# EasyEDA Pro project EjemploESP32.epro

# Schematic Schematic1_V2

## Sheets
1 P1: Board Name: Board_INA219_V2; Create Date: 2026-09-01; Page Name: P1; Project Name: Project Name; Schematic Name: Schematic Name; Update Date: 2021.11.05; Company: EasyEDA.com; Page Size: A4; Version: V1.0
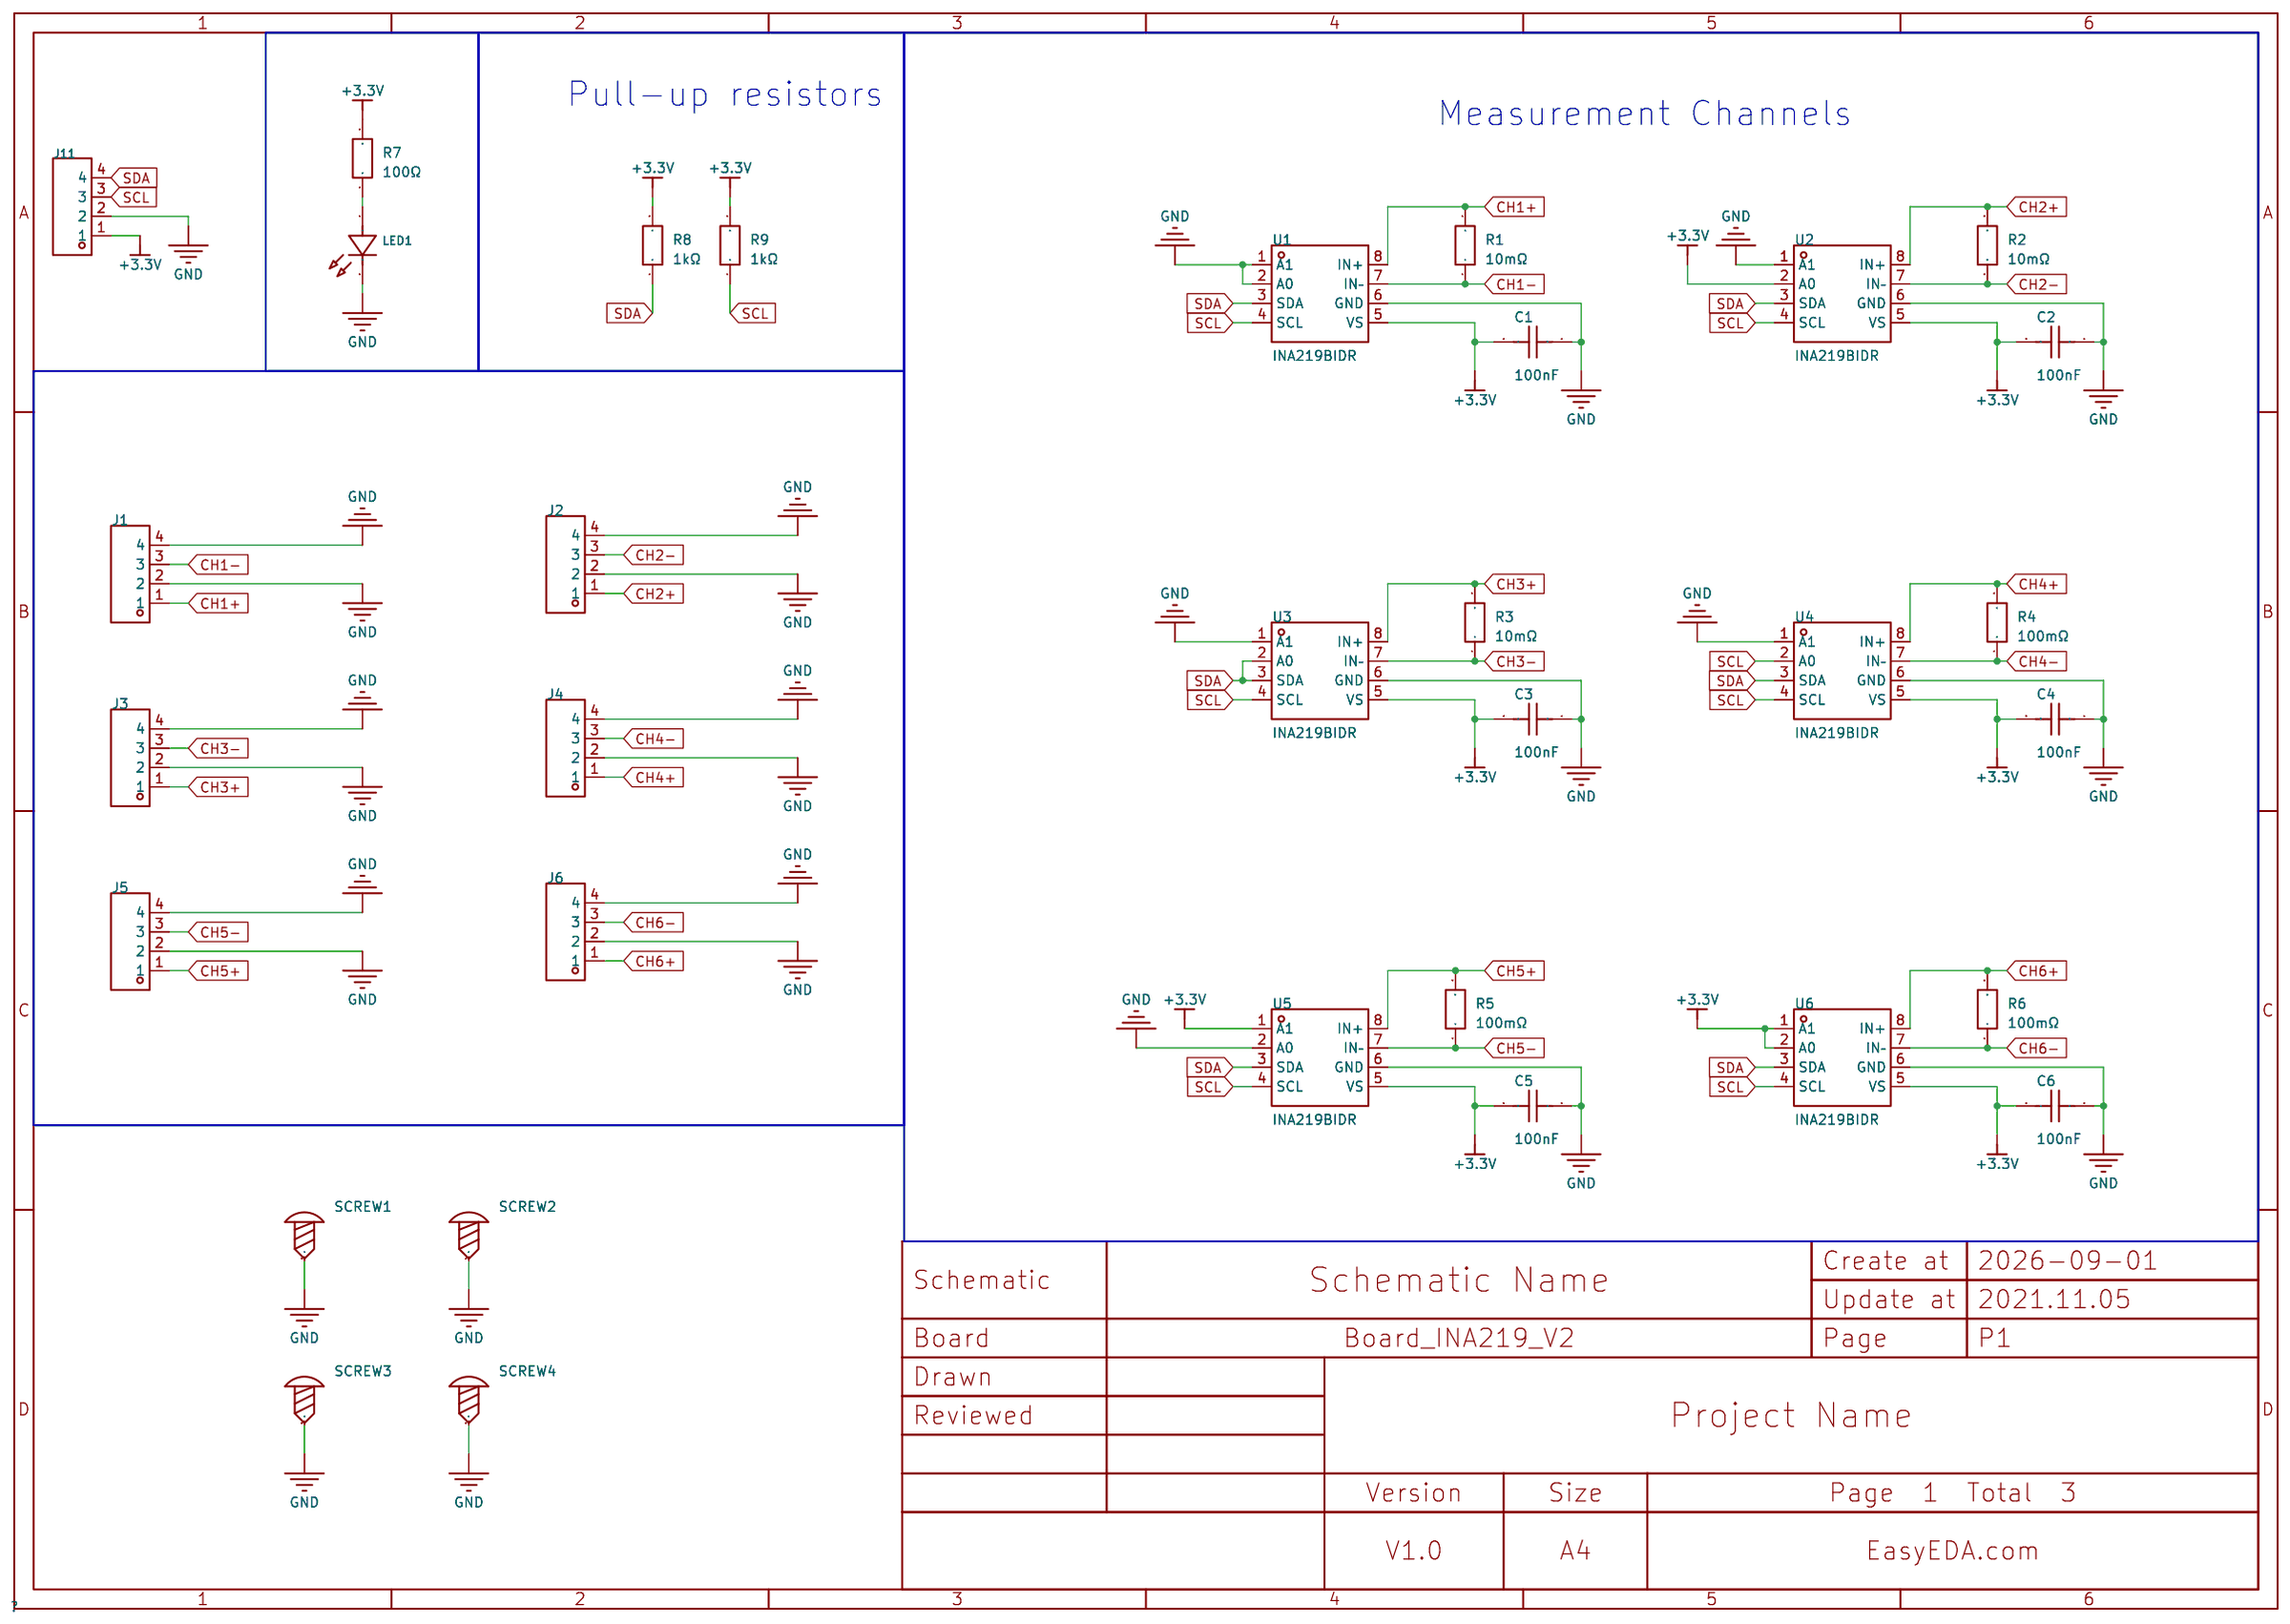
[diagram p0: P1]
2 P2: Create Date: 2026-09-20; Page Name: P2; Project Name: Measurment Unit; Schematic Name: Schematic1_V2; Update Date: 2026-09-20
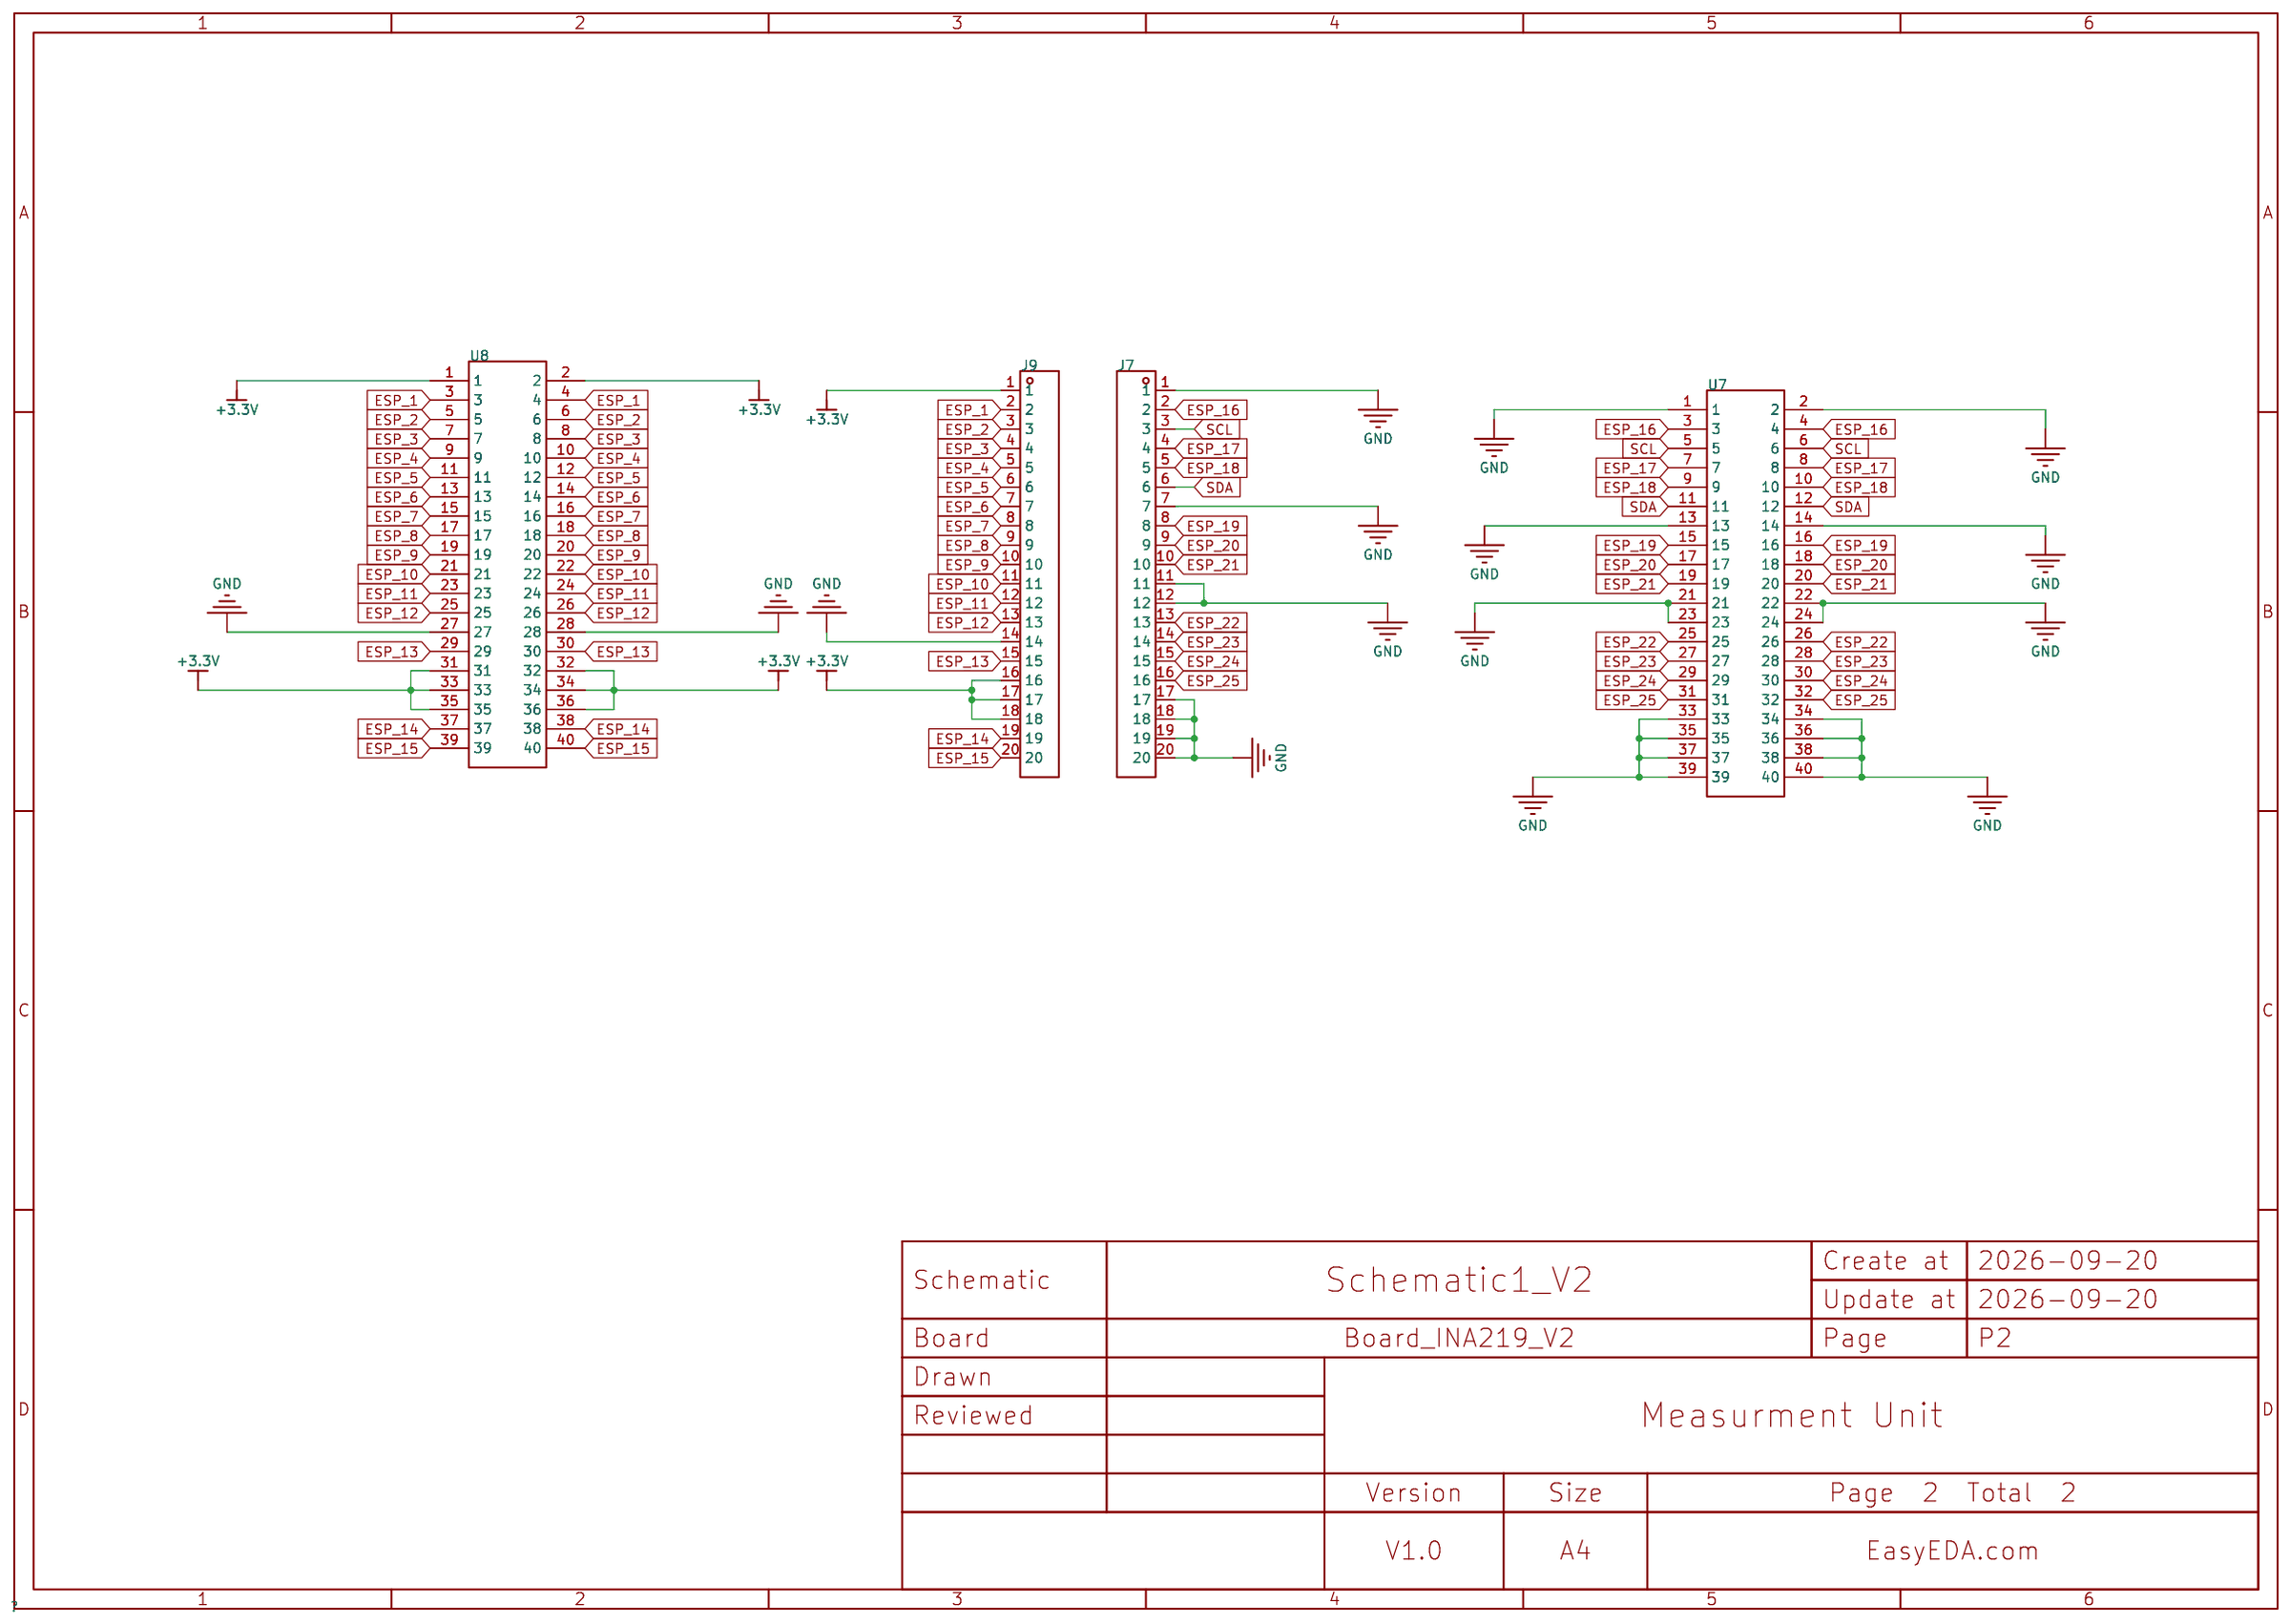
[diagram p1: P2]

## Parts
sheet P1
C1  100nF  [C0805]
C2  100nF  [C0805]
C3  100nF  [C0805]
C4  100nF  [C0805]
C5  100nF  [C0805]
C6  100nF  [C0805]
J1  JL301-50004U02  [CONN-TH_4P-P5.00_JL301-50004U02]
J2  JL301-50004U02  [CONN-TH_4P-P5.00_JL301-50004U02]
J3  JL301-50004U02  [CONN-TH_4P-P5.00_JL301-50004U02]
J4  JL301-50004U02  [CONN-TH_4P-P5.00_JL301-50004U02]
J5  JL301-50004U02  [CONN-TH_4P-P5.00_JL301-50004U02]
J6  JL301-50004U02  [CONN-TH_4P-P5.00_JL301-50004U02]
J11  PM2.54-1*4  [HDR-TH_4P-P2.54-V-F]
LED1  XL-3216SURC  [LED1206-R-RD_RED]
R1  10mΩ  [R2512]
R2  10mΩ  [R2512]
R3  10mΩ  [R2512]
R4  100mΩ  [R2512]
R5  100mΩ  [R2512]
R6  100mΩ  [R2512]
R7  100Ω  [R1206]
R8  1kΩ  [R1206]
R9  1kΩ  [R1206]
SCREW1  -  [Screw-Hole-M2]
SCREW2  -  [Screw-Hole-M2]
SCREW3  -  [Screw-Hole-M2]
SCREW4  -  [Screw-Hole-M2]
U1  INA219BIDR  [SOIC-8_L5.0-W4.0-P1.27-LS6.1-BL]
U2  INA219BIDR  [SOIC-8_L5.0-W4.0-P1.27-LS6.1-BL]
U3  INA219BIDR  [SOIC-8_L5.0-W4.0-P1.27-LS6.1-BL]
U4  INA219BIDR  [SOIC-8_L5.0-W4.0-P1.27-LS6.1-BL]
U5  INA219BIDR  [SOIC-8_L5.0-W4.0-P1.27-LS6.1-BL]
U6  INA219BIDR  [SOIC-8_L5.0-W4.0-P1.27-LS6.1-BL]
sheet P2
J7  ZX-PM2.54-1-20PY  [HDR-TH_20P-P2.54-V-F]
J9  ZX-PM2.54-1-20PY  [HDR-TH_20P-P2.54-V-F]
U7  2.54-2*20  [HDR-TH_40P-P2.54-V-F-R2-C20-S2.54]
U8  2.54-2*20  [HDR-TH_40P-P2.54-V-F-R2-C20-S2.54]

## Library data of the parts
C1-C6 = CAP_0805: Supplier Footprint: 0805
J1-J6 = JL301-50004U02: Number of Positions or Pins:1x4P Pitch:5mm Color:Blue Mounting Type:Through Hole Number of Pins:4P Number of Rows:1 Number of PINs Per Row:4 Screw Specification:M2.5 Current Rating:15A Voltage Rating (Max):300V Wire Gauge - AWG:12~24 Operating Temperature; LCSC Part Name: 1x4P 5mm 直插 排数:1 每排P数:4; Supplier Part: C409137; Manufacturer: JILN(锦凌); Supplier Footprint: 插件,P=5mm; JLCPCB Part Class: Extended Part; Datasheet: https://item.szlcsc.com/datasheet/JL301-50004U02/399067.html; Supplier: LCSC; Number of Positions or Pins: 1x4P; Pitch: 5mm; Color: Blue; Mounting Type: Through Hole; Number of Pins: 4P; Number of Rows: 1; Number of PINs Per Row: 4; Screw Specification: M2.5; Current Rating: 15A; Voltage Rating (Max): 300V; Wire Gauge - AWG: 12~24; Operating Temperature: -40℃~+105℃; Height Above Board: 10.1mm
J11 = PM2.54-1*4: Holes Structure:1x4P Pitch:2.54mm Row Spacing:2.54mm Circular Hole / Square Hole:Square Hole Mounting Type:Through Hole Number of Rows:1 Number of Positions:4P Current Rating:2.5A Holes Direction:Top Insulation Height:8.5mm Operating Temperature:-40℃~+105; LCSC Part Name: 间距:2.54mm 1x4P 直插; Supplier Part: C5116530; Manufacturer: ZHOURI(洲日); Supplier Footprint: 插件,P=2.54mm; JLCPCB Part Class: Extended Part; Datasheet: https://item.szlcsc.com/datasheet/PM2.54-1*4/5692947.html; Supplier: LCSC; Holes Structure: 1x4P; Pitch: 2.54mm; Row Spacing: 2.54mm; Circular Hole / Square Hole: Square Hole; Mounting Type: Through Hole; Number of Rows: 1; Number of Positions: 4P; Current Rating: 2.5A; Holes Direction: Top; Insulation Height: 8.5mm; Operating Temperature: -40℃~+105℃
LED1 = XL-3216SURC: Lamp Holder Type:3.2mm x 1.6mm square LED Illumination Color:Red Voltage - Forward(Vf):2.4V Voltage - Forward(Vf):2.4V Power(Watts):50mW Forward Current:20mA Wavelength - Dominant:615nm~630nm Wavelength - Dominant:615nm~630nm Peak Wavelength:620nm Peak Wa; LCSC Part Name: 1206红贴片式发光二极管; Supplier Part: C965822; Manufacturer: XINGLIGHT(成兴光); Supplier Footprint: 1206; JLCPCB Part Class: Extended Part; Datasheet: https://item.szlcsc.com/datasheet/XL-3216SURC/1051431.html; Supplier: LCSC; Lamp Holder Type: 3.2mm x 1.6mm square LED; Illumination Color: Red; Voltage - Forward(Vf): 2.4V; Power(Watts): 50mW; Forward Current: 20mA; Wavelength - Dominant: 615nm~630nm; Peak Wavelength: 620nm; Diode Configuration: Discrete Diode; Lens Color: Water Clear; Luminous Intensity: 225mcd; Viewing Angle: 120°; Mounting Style: Top-mount; Operating Temperature: -40℃~+85℃
R1-R3 = FRM252WJR010TN: Type:Current Sense Resistor Resistance:10mΩ Tolerance:±5% Tolerance:±5% Power(Watts):2W Temperature Coefficient:±50ppm/℃ Temperature Coefficient:±50ppm/℃ Mounting Type:SMD; LCSC Part Name: 10mΩ ±5% 2W 合金电阻; Supplier Part: C7420034; Manufacturer: FOJAN(富捷); Supplier Footprint: 2512; JLCPCB Part Class: Extended Part; Datasheet: https://item.szlcsc.com/datasheet/FRM252WJR010TN/8395327.html; Supplier: LCSC; Type: Current Sense Resistor; Tolerance: ±5%; Power(Watts): 2W; Temperature Coefficient: ±50ppm/℃; Mounting Type: SMD
R4-R6 = FRM252WJR100TN: Type:Current Sense Resistor Resistance:100mΩ Tolerance:±5% Tolerance:±5% Voltage Rating:- Power(Watts):2W Current Rating:- Temperature Coefficient:±50ppm/℃ Temperature Coefficient:±50ppm/℃ Mounting Type:-; LCSC Part Name: 100mΩ ±5% 2W; Supplier Part: C7467234; Manufacturer: FOJAN(富捷); Supplier Footprint: 2512; JLCPCB Part Class: Extended Part; Datasheet: https://item.szlcsc.com/datasheet/FRM252WJR100TN/8513834.html; Supplier: LCSC; Type: Current Sense Resistor; Tolerance: ±5%; Power(Watts): 2W; Temperature Coefficient: ±50ppm/℃
R7 = FRC1206J101 TS: Type:Thick Film Resistor Resistance:100Ω Tolerance:±5% Tolerance:±5% Power(Watts):250mW Voltage-Supply(Max):200V Temperature Coefficient:±100ppm/℃ Temperature Coefficient:±100ppm/℃ Operating Temperature:-55℃~+155℃ Operating Temperature:-55℃~+155℃; LCSC Part Name: 100Ω ±5% 250mW 厚膜电阻; Supplier Part: C2907422; Manufacturer: FOJAN(富捷); Supplier Footprint: 1206; JLCPCB Part Class: Extended Part; Supplier: LCSC; Type: Thick Film Resistor; Tolerance: ±5%; Power(Watts): 250mW; Voltage-Supply(Max): 200V; Temperature Coefficient: ±100ppm/℃; Operating Temperature: -55℃~+155℃
R8 R9 = FRC1206J102 TS: Type:Thick Film Resistor Resistance:1kΩ Tolerance:±5% Tolerance:±5% Power(Watts):250mW Voltage-Supply(Max):200V Temperature Coefficient:±100ppm/℃ Temperature Coefficient:±100ppm/℃ Operating Temperature:-55℃~+155℃ Operating Temperature:-55℃~+155℃; LCSC Part Name: 1kΩ ±5% 250mW 厚膜电阻; Supplier Part: C2907440; Manufacturer: FOJAN(富捷); Supplier Footprint: 1206; JLCPCB Part Class: Extended Part; Supplier: LCSC; Type: Thick Film Resistor; Tolerance: ±5%; Power(Watts): 250mW; Voltage-Supply(Max): 200V; Temperature Coefficient: ±100ppm/℃; Operating Temperature: -55℃~+155℃
SCREW1-SCREW4 = Screw-Hole-M2: Supplier Footprint: 插件
U1-U6 = INA219BIDR: Number of Channels:- Vcm - Common Mode Voltage:300mV~26V Vcm - Common Mode Voltage:300mV~26V Gain:- Bandwidth:- Ib - Input Bias Current:20uA Vos - Input Offset Voltage:10uV Operating Temperature:-40℃~+125℃ Operating Temperature:-40℃~+125℃ Differential Vol; LCSC Part Name: 具有I2C接口的零漂移双向电流/功率监测计; Supplier Part: C2155799; Manufacturer: TI(德州仪器); Supplier Footprint: SOIC-8; JLCPCB Part Class: Extended Part; Datasheet: https://www.ti.com/cn/lit/gpn/ina219; Supplier: LCSC; Vcm - Common Mode Voltage: 300mV~26V; Ib - Input Bias Current: 20uA; Vos - Input Offset Voltage: 10uV; Operating Temperature: -40℃~+125℃; Differential Voltage: -26V~+26V; Single Supply: 3V~5.5V; Quiescent Current: 700uA; Input Offset Voltage Drift(Vos TC): 0.1uV/℃; Common Mode Rejection Ratio (CMRR): 120dB
J7 J9 = ZX-PM2.54-1-20PY: Holes Structure:1x20P Pitch:2.54mm Row Spacing:- Circular Hole / Square Hole:Square Hole Mounting Type:Through Hole Number of Rows:1 Number of Positions:20P Current Rating:3A Voltage Rating (Max):- Holes Direction:Top Insulation Height:8.5mm Contact Mater; LCSC Part Name: 1x20P 间距:2.54mm 直插; Supplier Part: C7499336; Manufacturer: Megastar(兆星); Supplier Footprint: 插件,P=2.54mm; JLCPCB Part Class: Extended Part; Datasheet: https://item.szlcsc.com/datasheet/ZX-PM2.54-1-20PY/8573997.html; Supplier: LCSC; Holes Structure: 1x20P; Pitch: 2.54mm; Circular Hole / Square Hole: Square Hole; Mounting Type: Through Hole; Number of Rows: 1; Number of Positions: 20P; Current Rating: 3A; Holes Direction: Top; Insulation Height: 8.5mm; Contact Material: Brass; Contact Plating: Gold; Operating Temperature: -40℃~+105℃; PIN Length: 3.2mm
U7 U8 = 2.54-2*20: Holes Structure:2x20P Pitch:2.54mm Row Spacing:2.54mm Circular Hole / Square Hole:Square Hole Mounting Type:Through Hole Number of Rows:2 Number of Positions:40P Current Rating:2.5A Voltage Rating (Max):- Holes Direction:Top Insulation Height:8.5mm Operat; LCSC Part Name: 间距:2.54mm 2x20P 直插; Supplier Part: C2977589; Manufacturer: ZHOURI(洲日); Supplier Footprint: 插件,P=2.54mm; JLCPCB Part Class: Extended Part; Datasheet: https://item.szlcsc.com/datasheet/2.54-2*20/3388941.html; Supplier: LCSC; Holes Structure: 2x20P; Pitch: 2.54mm; Row Spacing: 2.54mm; Circular Hole / Square Hole: Square Hole; Mounting Type: Through Hole; Number of Rows: 2; Number of Positions: 40P; Current Rating: 2.5A; Holes Direction: Top; Insulation Height: 8.5mm; Operating Temperature: -40℃~+105℃

## Nets
+3.3V: C1.2 C2.2 C3.2 C4.2 C5.2 C6.2 J9.1 J9.16 J9.17 J9.18 J11.1 R7.2 R8.2 R9.2 U1.5(VS) U2.2(A0) U2.5(VS) U3.5(VS) U4.5(VS) U5.1(A1) U5.5(VS) U6.1(A1) U6.2(A0) U6.5(VS) U8.1 U8.2 U8.31 U8.32 U8.33 U8.34 U8.35 U8.36
GND: C1.1 C2.1 C3.1 C4.1 C5.1 C6.1 J1.2 J1.4 J2.2 J2.4 J3.2 J3.4 J4.2 J4.4 J5.2 J5.4 J6.2 J6.4 J7.1 J7.7 J7.11 J7.12 J7.17 J7.18 J7.19 J7.20 J9.14 J11.2 LED1.2(A) SCREW1.1 SCREW2.1 SCREW3.1 SCREW4.1 U1.1(A1) U1.2(A0) U1.6(GND) U2.1(A1) U2.6(GND) U3.1(A1) U3.6(GND) U4.1(A1) U4.6(GND) U5.2(A0) U5.6(GND) U6.6(GND) U7.1 U7.2 U7.13 U7.14 U7.21 U7.22 U7.23 U7.24 U7.33 U7.34 U7.35 U7.36 U7.37 U7.38 U7.39 U7.40 U8.27 U8.28
CH1+: J1.1 R1.2 U1.8(IN+)
CH1-: J1.3 R1.1 U1.7(IN–)
CH2+: J2.1 R2.2 U2.8(IN+)
CH2-: J2.3 R2.1 U2.7(IN–)
CH3+: J3.1 R3.2 U3.8(IN+)
CH3-: J3.3 R3.1 U3.7(IN–)
CH4+: J4.1 R4.2 U4.8(IN+)
CH4-: J4.3 R4.1 U4.7(IN–)
CH5+: J5.1 R5.2 U5.8(IN+)
CH5-: J5.3 R5.1 U5.7(IN–)
CH6+: J6.1 R6.2 U6.8(IN+)
CH6-: J6.3 R6.1 U6.7(IN–)
ESP_1: J9.2 U8.3 U8.4
ESP_2: J9.3 U8.5 U8.6
ESP_3: J9.4 U8.7 U8.8
ESP_4: J9.5 U8.9 U8.10
ESP_5: J9.6 U8.11 U8.12
ESP_6: J9.7 U8.13 U8.14
ESP_7: J9.8 U8.15 U8.16
ESP_8: J9.9 U8.17 U8.18
ESP_9: J9.10 U8.19 U8.20
ESP_10: J9.11 U8.21 U8.22
ESP_11: J9.12 U8.23 U8.24
ESP_12: J9.13 U8.25 U8.26
ESP_13: J9.15 U8.29 U8.30
ESP_14: J9.19 U8.37 U8.38
ESP_15: J9.20 U8.39 U8.40
ESP_16: J7.2 U7.3 U7.4
ESP_17: J7.4 U7.7 U7.8
ESP_18: J7.5 U7.9 U7.10
ESP_19: J7.8 U7.15 U7.16
ESP_20: J7.9 U7.17 U7.18
ESP_21: J7.10 U7.19 U7.20
ESP_22: J7.13 U7.25 U7.26
ESP_23: J7.14 U7.27 U7.28
ESP_24: J7.15 U7.29 U7.30
ESP_25: J7.16 U7.31 U7.32
SCL: J7.3 J11.3 R9.1 U1.4(SCL) U2.4(SCL) U3.4(SCL) U4.2(A0) U4.4(SCL) U5.4(SCL) U6.4(SCL) U7.5 U7.6
SDA: J7.6 J11.4 R8.1 U1.3(SDA) U2.3(SDA) U3.2(A0) U3.3(SDA) U4.3(SDA) U5.3(SDA) U6.3(SDA) U7.11 U7.12
$1N117: LED1.1(K) R7.1

## Notes on the sheets
sheet 1
- Pull-up resistors
- Measurement Channels

# Schematic Schematic1

## Sheets
1 P1: Create Date: 2026-09-01; Page Name: P1; Project Name: Project Name; Schematic Name: Schematic Name; Update Date: 2021.11.05; Company: EasyEDA.com; Page Size: A4; Version: V1.0
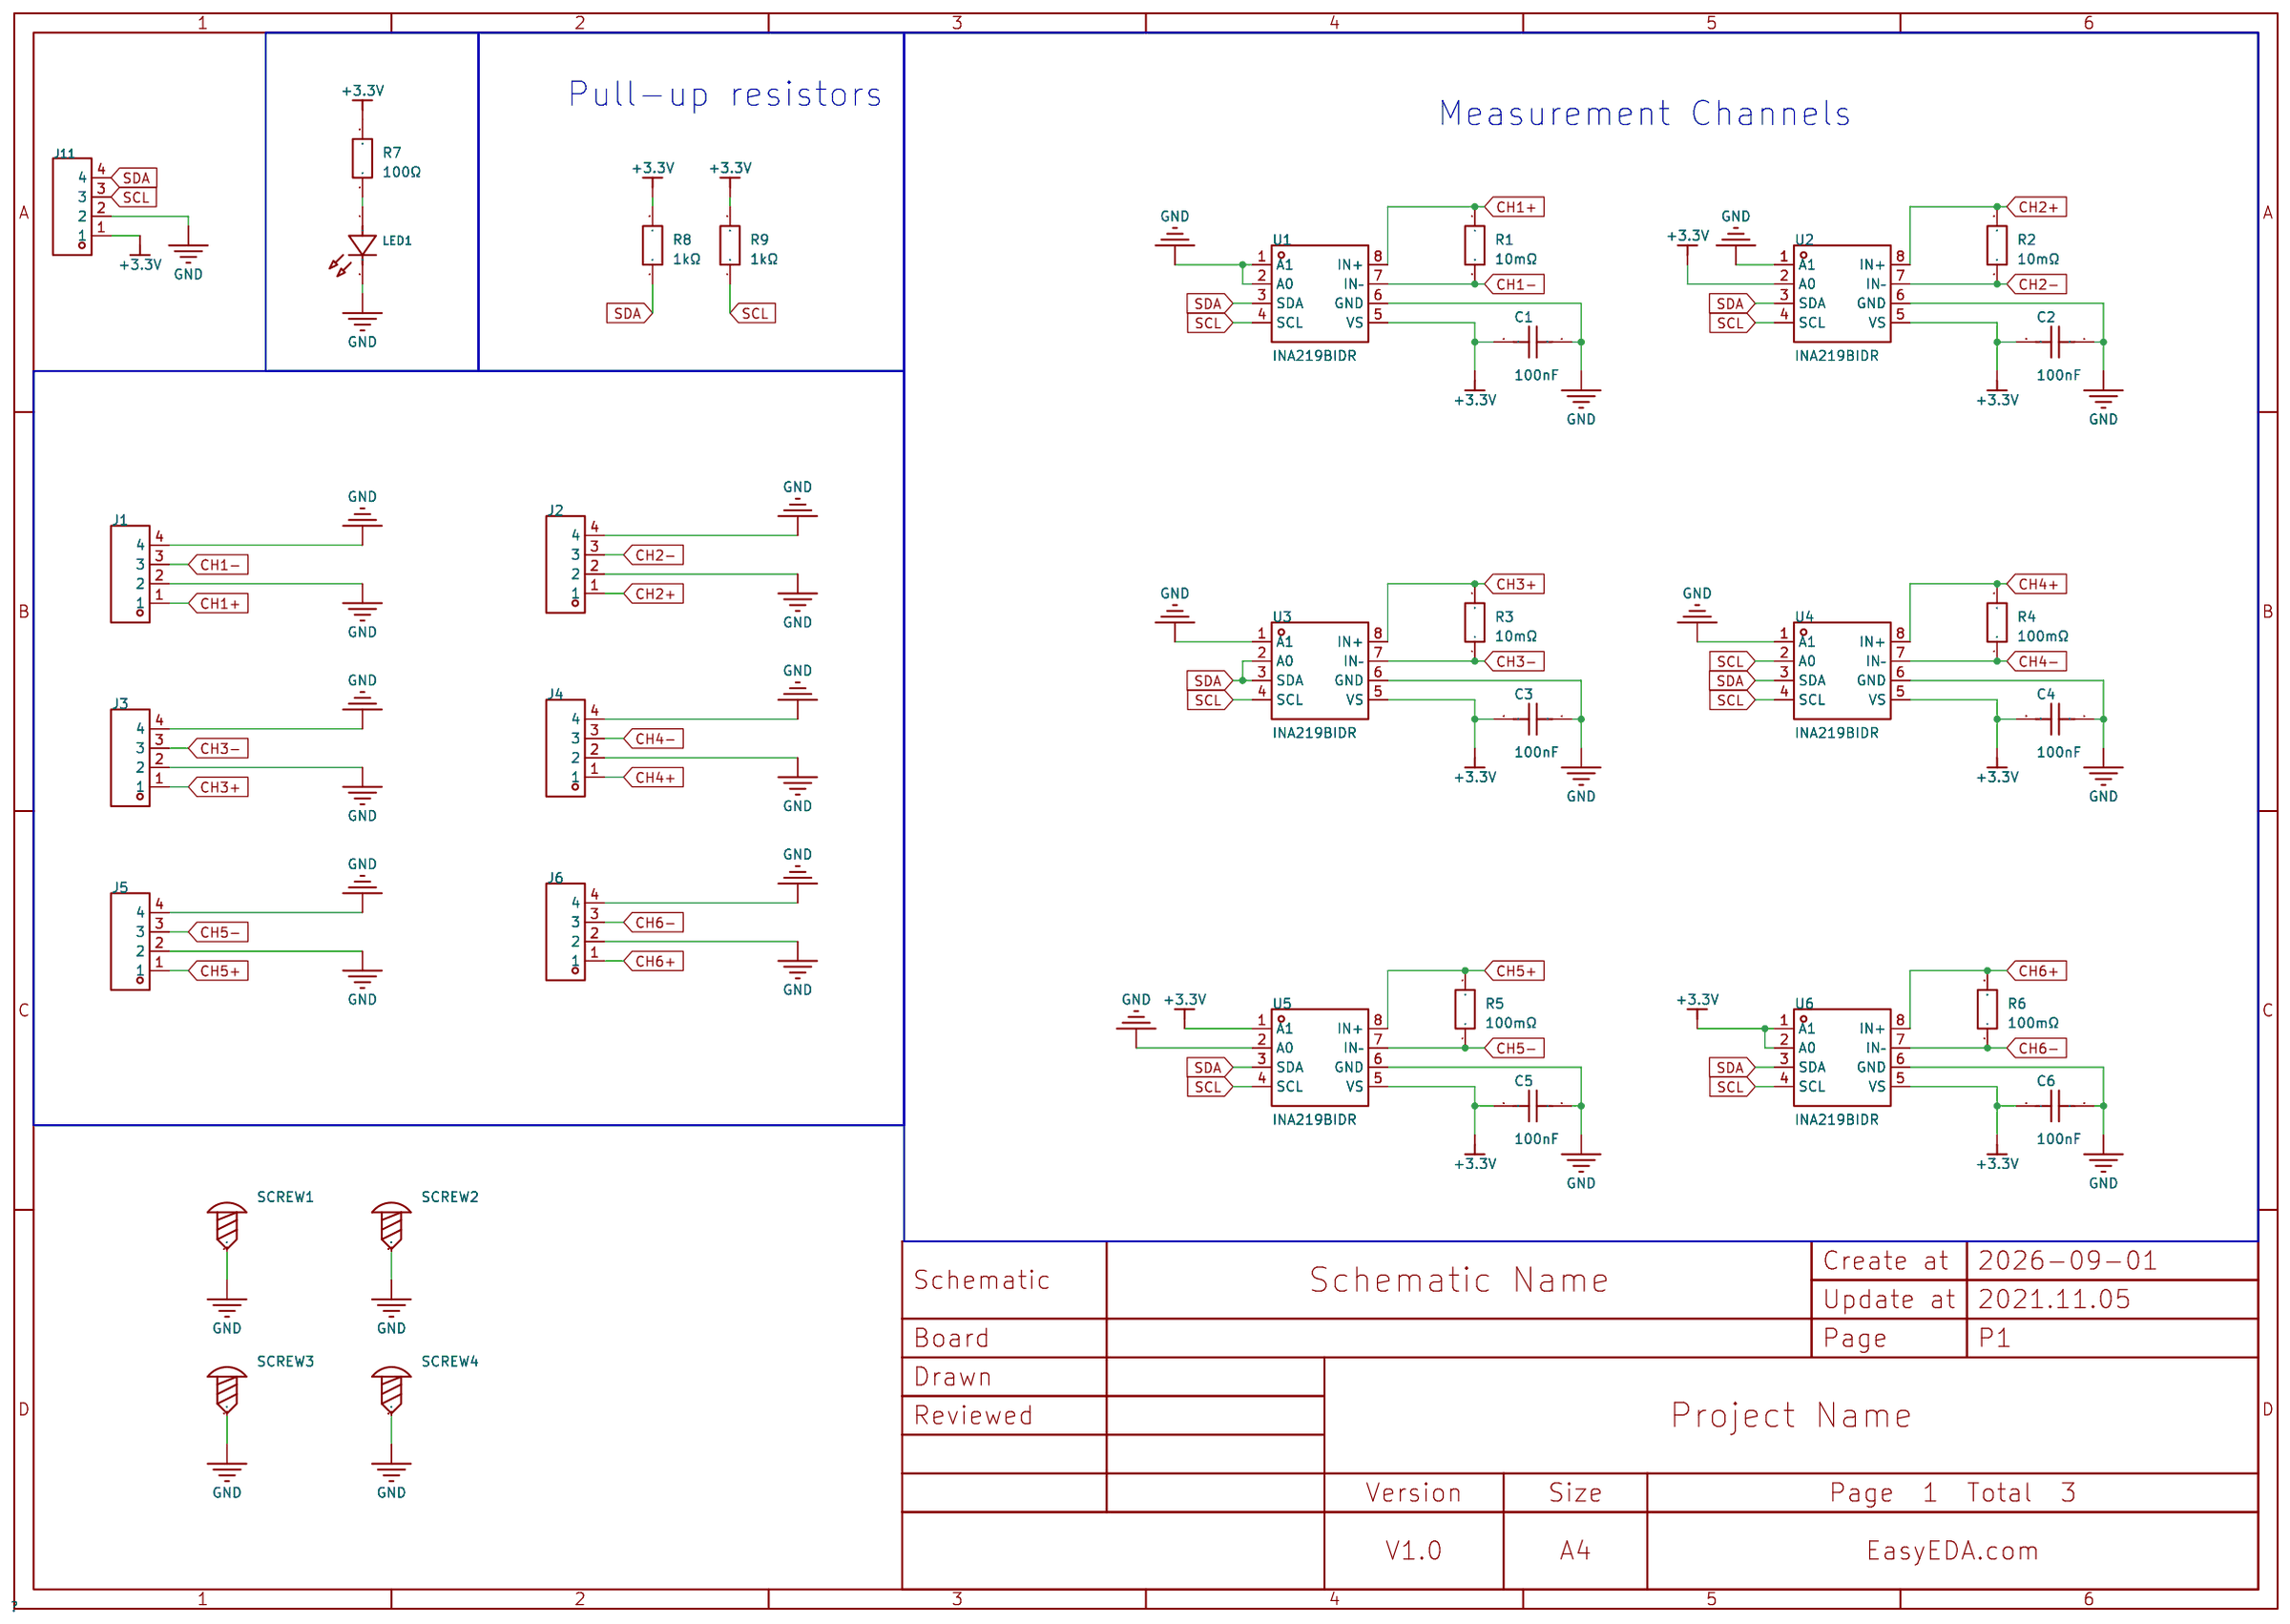
[diagram p2: P1]
2 P2: Board Name: Board_INA219_V1; Create Date: 2026-09-20; Page Name: P2; Project Name: Measurment Unit; Schematic Name: Schematic1; Update Date: 2026-09-20
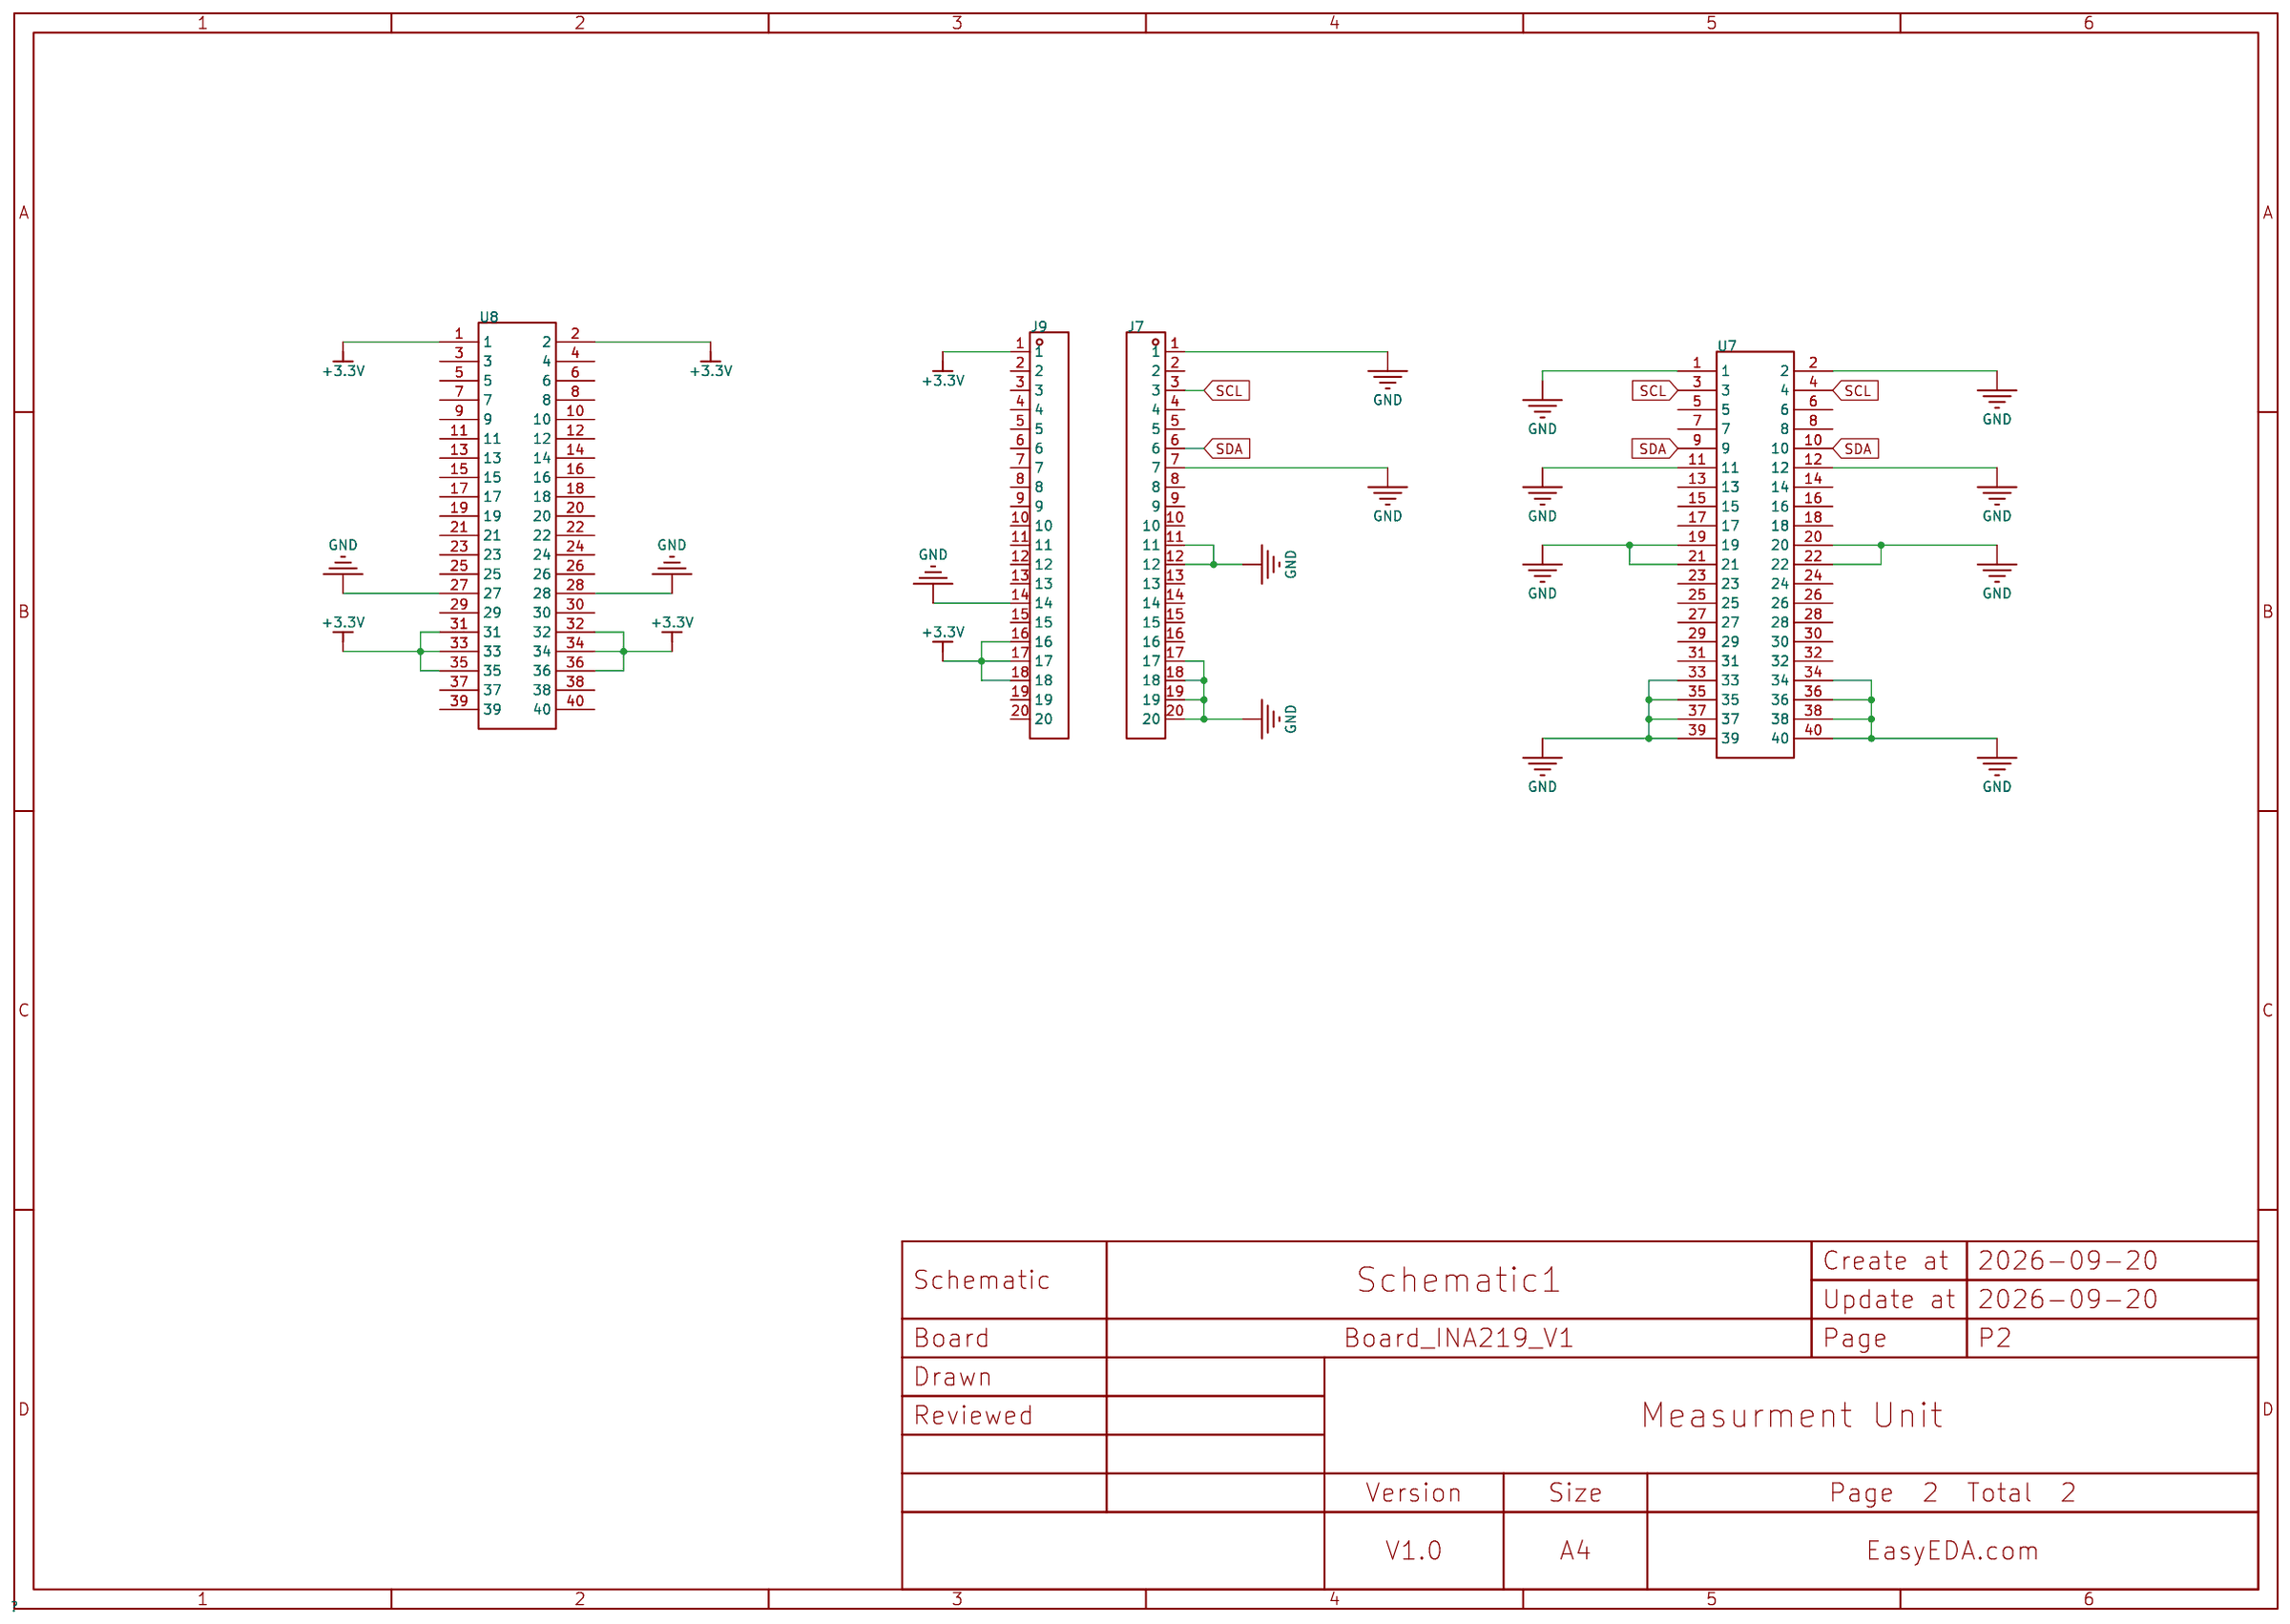
[diagram p3: P2]

## Parts
sheet P1
C1  100nF  [C0805]
C2  100nF  [C0805]
C3  100nF  [C0805]
C4  100nF  [C0805]
C5  100nF  [C0805]
C6  100nF  [C0805]
J1  JL301-50004U02  [CONN-TH_4P-P5.00_JL301-50004U02]
J2  JL301-50004U02  [CONN-TH_4P-P5.00_JL301-50004U02]
J3  JL301-50004U02  [CONN-TH_4P-P5.00_JL301-50004U02]
J4  JL301-50004U02  [CONN-TH_4P-P5.00_JL301-50004U02]
J5  JL301-50004U02  [CONN-TH_4P-P5.00_JL301-50004U02]
J6  JL301-50004U02  [CONN-TH_4P-P5.00_JL301-50004U02]
J11  PM2.54-1*4  [HDR-TH_4P-P2.54-V-F]
LED1  XL-3216SURC  [LED1206-R-RD_RED]
R1  10mΩ  [R1206]
R2  10mΩ  [R1206]
R3  10mΩ  [R1206]
R4  100mΩ  [R1206]
R5  100mΩ  [R1206]
R6  100mΩ  [R1206]
R7  100Ω  [R1206]
R8  1kΩ  [R1206]
R9  1kΩ  [R1206]
SCREW1  -  [Screw-Hole-M2]
SCREW2  -  [Screw-Hole-M2]
SCREW3  -  [Screw-Hole-M2]
SCREW4  -  [Screw-Hole-M2]
U1  INA219BIDR  [SOIC-8_L5.0-W4.0-P1.27-LS6.1-BL]
U2  INA219BIDR  [SOIC-8_L5.0-W4.0-P1.27-LS6.1-BL]
U3  INA219BIDR  [SOIC-8_L5.0-W4.0-P1.27-LS6.1-BL]
U4  INA219BIDR  [SOIC-8_L5.0-W4.0-P1.27-LS6.1-BL]
U5  INA219BIDR  [SOIC-8_L5.0-W4.0-P1.27-LS6.1-BL]
U6  INA219BIDR  [SOIC-8_L5.0-W4.0-P1.27-LS6.1-BL]
sheet P2
J7  ZX-PM2.54-1-20PY  [HDR-TH_20P-P2.54-V-F]
J9  ZX-PM2.54-1-20PY  [HDR-TH_20P-P2.54-V-F]
U7  2.54-2*20  [HDR-TH_40P-P2.54-V-F-R2-C20-S2.54]
U8  2.54-2*20  [HDR-TH_40P-P2.54-V-F-R2-C20-S2.54]

## Library data of the parts
C1-C6 = CAP_0805: Supplier Footprint: 0805
J1-J6 = JL301-50004U02: Number of Positions or Pins:1x4P Pitch:5mm Color:Blue Mounting Type:Through Hole Number of Pins:4P Number of Rows:1 Number of PINs Per Row:4 Screw Specification:M2.5 Current Rating:15A Voltage Rating (Max):300V Wire Gauge - AWG:12~24 Operating Temperature; LCSC Part Name: 1x4P 5mm 直插 排数:1 每排P数:4; Supplier Part: C409137; Manufacturer: JILN(锦凌); Supplier Footprint: 插件,P=5mm; JLCPCB Part Class: Extended Part; Datasheet: https://item.szlcsc.com/datasheet/JL301-50004U02/399067.html; Supplier: LCSC; Number of Positions or Pins: 1x4P; Pitch: 5mm; Color: Blue; Mounting Type: Through Hole; Number of Pins: 4P; Number of Rows: 1; Number of PINs Per Row: 4; Screw Specification: M2.5; Current Rating: 15A; Voltage Rating (Max): 300V; Wire Gauge - AWG: 12~24; Operating Temperature: -40℃~+105℃; Height Above Board: 10.1mm
J11 = PM2.54-1*4: Holes Structure:1x4P Pitch:2.54mm Row Spacing:2.54mm Circular Hole / Square Hole:Square Hole Mounting Type:Through Hole Number of Rows:1 Number of Positions:4P Current Rating:2.5A Holes Direction:Top Insulation Height:8.5mm Operating Temperature:-40℃~+105; LCSC Part Name: 间距:2.54mm 1x4P 直插; Supplier Part: C5116530; Manufacturer: ZHOURI(洲日); Supplier Footprint: 插件,P=2.54mm; JLCPCB Part Class: Extended Part; Datasheet: https://item.szlcsc.com/datasheet/PM2.54-1*4/5692947.html; Supplier: LCSC; Holes Structure: 1x4P; Pitch: 2.54mm; Row Spacing: 2.54mm; Circular Hole / Square Hole: Square Hole; Mounting Type: Through Hole; Number of Rows: 1; Number of Positions: 4P; Current Rating: 2.5A; Holes Direction: Top; Insulation Height: 8.5mm; Operating Temperature: -40℃~+105℃
LED1 = XL-3216SURC: Lamp Holder Type:3.2mm x 1.6mm square LED Illumination Color:Red Voltage - Forward(Vf):2.4V Voltage - Forward(Vf):2.4V Power(Watts):50mW Forward Current:20mA Wavelength - Dominant:615nm~630nm Wavelength - Dominant:615nm~630nm Peak Wavelength:620nm Peak Wa; LCSC Part Name: 1206红贴片式发光二极管; Supplier Part: C965822; Manufacturer: XINGLIGHT(成兴光); Supplier Footprint: 1206; JLCPCB Part Class: Extended Part; Datasheet: https://item.szlcsc.com/datasheet/XL-3216SURC/1051431.html; Supplier: LCSC; Lamp Holder Type: 3.2mm x 1.6mm square LED; Illumination Color: Red; Voltage - Forward(Vf): 2.4V; Power(Watts): 50mW; Forward Current: 20mA; Wavelength - Dominant: 615nm~630nm; Peak Wavelength: 620nm; Diode Configuration: Discrete Diode; Lens Color: Water Clear; Luminous Intensity: 225mcd; Viewing Angle: 120°; Mounting Style: Top-mount; Operating Temperature: -40℃~+85℃
R1-R3 = FRM121WFR010TM: Type:Current Sense Resistor Resistance:10mΩ Tolerance:±1% Tolerance:±1% Voltage Rating:- Power(Watts):1W Current Rating:- Temperature Coefficient:±50ppm/℃ Temperature Coefficient:±50ppm/℃ Mounting Type:-; LCSC Part Name: 10mΩ ±1% 1W; Supplier Part: C7467248; Manufacturer: FOJAN(富捷); Supplier Footprint: 1206; JLCPCB Part Class: Extended Part; Datasheet: https://item.szlcsc.com/datasheet/FRM121WFR010TM/8513848.html; Supplier: LCSC; Type: Current Sense Resistor; Tolerance: ±1%; Power(Watts): 1W; Temperature Coefficient: ±50ppm/℃
R4-R6 = FRM121WFR100TM: Type:Current Sense Resistor Resistance:100mΩ Tolerance:±1% Tolerance:±1% Voltage Rating:- Power(Watts):1W Current Rating:- Temperature Coefficient:±50ppm/℃ Temperature Coefficient:±50ppm/℃ Mounting Type:-; LCSC Part Name: 100mΩ ±1% 1W; Supplier Part: C7467250; Manufacturer: FOJAN(富捷); Supplier Footprint: 1206; JLCPCB Part Class: Extended Part; Datasheet: https://item.szlcsc.com/datasheet/FRM121WFR100TM/8513850.html; Supplier: LCSC; Type: Current Sense Resistor; Tolerance: ±1%; Power(Watts): 1W; Temperature Coefficient: ±50ppm/℃
R7 = FRC1206J101 TS: Type:Thick Film Resistor Resistance:100Ω Tolerance:±5% Tolerance:±5% Power(Watts):250mW Voltage-Supply(Max):200V Temperature Coefficient:±100ppm/℃ Temperature Coefficient:±100ppm/℃ Operating Temperature:-55℃~+155℃ Operating Temperature:-55℃~+155℃; LCSC Part Name: 100Ω ±5% 250mW 厚膜电阻; Supplier Part: C2907422; Manufacturer: FOJAN(富捷); Supplier Footprint: 1206; JLCPCB Part Class: Extended Part; Supplier: LCSC; Type: Thick Film Resistor; Tolerance: ±5%; Power(Watts): 250mW; Voltage-Supply(Max): 200V; Temperature Coefficient: ±100ppm/℃; Operating Temperature: -55℃~+155℃
R8 R9 = FRC1206J102 TS: Type:Thick Film Resistor Resistance:1kΩ Tolerance:±5% Tolerance:±5% Power(Watts):250mW Voltage-Supply(Max):200V Temperature Coefficient:±100ppm/℃ Temperature Coefficient:±100ppm/℃ Operating Temperature:-55℃~+155℃ Operating Temperature:-55℃~+155℃; LCSC Part Name: 1kΩ ±5% 250mW 厚膜电阻; Supplier Part: C2907440; Manufacturer: FOJAN(富捷); Supplier Footprint: 1206; JLCPCB Part Class: Extended Part; Supplier: LCSC; Type: Thick Film Resistor; Tolerance: ±5%; Power(Watts): 250mW; Voltage-Supply(Max): 200V; Temperature Coefficient: ±100ppm/℃; Operating Temperature: -55℃~+155℃
SCREW1-SCREW4 = Screw-Hole-M2: Supplier Footprint: 插件
U1-U6 = INA219BIDR: Number of Channels:- Vcm - Common Mode Voltage:300mV~26V Vcm - Common Mode Voltage:300mV~26V Gain:- Bandwidth:- Ib - Input Bias Current:20uA Vos - Input Offset Voltage:10uV Operating Temperature:-40℃~+125℃ Operating Temperature:-40℃~+125℃ Differential Vol; LCSC Part Name: 具有I2C接口的零漂移双向电流/功率监测计; Supplier Part: C2155799; Manufacturer: TI(德州仪器); Supplier Footprint: SOIC-8; JLCPCB Part Class: Extended Part; Datasheet: https://www.ti.com/cn/lit/gpn/ina219; Supplier: LCSC; Vcm - Common Mode Voltage: 300mV~26V; Ib - Input Bias Current: 20uA; Vos - Input Offset Voltage: 10uV; Operating Temperature: -40℃~+125℃; Differential Voltage: -26V~+26V; Single Supply: 3V~5.5V; Quiescent Current: 700uA; Input Offset Voltage Drift(Vos TC): 0.1uV/℃; Common Mode Rejection Ratio (CMRR): 120dB
J7 J9 = ZX-PM2.54-1-20PY: Holes Structure:1x20P Pitch:2.54mm Row Spacing:- Circular Hole / Square Hole:Square Hole Mounting Type:Through Hole Number of Rows:1 Number of Positions:20P Current Rating:3A Voltage Rating (Max):- Holes Direction:Top Insulation Height:8.5mm Contact Mater; LCSC Part Name: 1x20P 间距:2.54mm 直插; Supplier Part: C7499336; Manufacturer: Megastar(兆星); Supplier Footprint: 插件,P=2.54mm; JLCPCB Part Class: Extended Part; Datasheet: https://item.szlcsc.com/datasheet/ZX-PM2.54-1-20PY/8573997.html; Supplier: LCSC; Holes Structure: 1x20P; Pitch: 2.54mm; Circular Hole / Square Hole: Square Hole; Mounting Type: Through Hole; Number of Rows: 1; Number of Positions: 20P; Current Rating: 3A; Holes Direction: Top; Insulation Height: 8.5mm; Contact Material: Brass; Contact Plating: Gold; Operating Temperature: -40℃~+105℃; PIN Length: 3.2mm
U7 U8 = 2.54-2*20: Holes Structure:2x20P Pitch:2.54mm Row Spacing:2.54mm Circular Hole / Square Hole:Square Hole Mounting Type:Through Hole Number of Rows:2 Number of Positions:40P Current Rating:2.5A Voltage Rating (Max):- Holes Direction:Top Insulation Height:8.5mm Operat; LCSC Part Name: 间距:2.54mm 2x20P 直插; Supplier Part: C2977589; Manufacturer: ZHOURI(洲日); Supplier Footprint: 插件,P=2.54mm; JLCPCB Part Class: Extended Part; Datasheet: https://item.szlcsc.com/datasheet/2.54-2*20/3388941.html; Supplier: LCSC; Holes Structure: 2x20P; Pitch: 2.54mm; Row Spacing: 2.54mm; Circular Hole / Square Hole: Square Hole; Mounting Type: Through Hole; Number of Rows: 2; Number of Positions: 40P; Current Rating: 2.5A; Holes Direction: Top; Insulation Height: 8.5mm; Operating Temperature: -40℃~+105℃

## Nets
+3.3V: C1.2 C2.2 C3.2 C4.2 C5.2 C6.2 J9.1 J9.16 J9.17 J9.18 J11.1 R7.2 R8.2 R9.2 U1.5(VS) U2.2(A0) U2.5(VS) U3.5(VS) U4.5(VS) U5.1(A1) U5.5(VS) U6.1(A1) U6.2(A0) U6.5(VS) U8.1 U8.2 U8.31 U8.32 U8.33 U8.34 U8.35 U8.36
GND: C1.1 C2.1 C3.1 C4.1 C5.1 C6.1 J1.2 J1.4 J2.2 J2.4 J3.2 J3.4 J4.2 J4.4 J5.2 J5.4 J6.2 J6.4 J7.1 J7.7 J7.11 J7.12 J7.17 J7.18 J7.19 J7.20 J9.14 J11.2 LED1.2(A) SCREW1.1 SCREW2.1 SCREW3.1 SCREW4.1 U1.1(A1) U1.2(A0) U1.6(GND) U2.1(A1) U2.6(GND) U3.1(A1) U3.6(GND) U4.1(A1) U4.6(GND) U5.2(A0) U5.6(GND) U6.6(GND) U7.1 U7.2 U7.11 U7.12 U7.19 U7.20 U7.21 U7.22 U7.33 U7.34 U7.35 U7.36 U7.37 U7.38 U7.39 U7.40 U8.27 U8.28
CH1+: J1.1 R1.1 U1.8(IN+)
CH1-: J1.3 R1.2 U1.7(IN–)
CH2+: J2.1 R2.2 U2.8(IN+)
CH2-: J2.3 R2.1 U2.7(IN–)
CH3+: J3.1 R3.2 U3.8(IN+)
CH3-: J3.3 R3.1 U3.7(IN–)
CH4+: J4.1 R4.2 U4.8(IN+)
CH4-: J4.3 R4.1 U4.7(IN–)
CH5+: J5.1 R5.2 U5.8(IN+)
CH5-: J5.3 R5.1 U5.7(IN–)
CH6+: J6.1 R6.2 U6.8(IN+)
CH6-: J6.3 R6.1 U6.7(IN–)
SCL: J7.3 J11.3 R9.1 U1.4(SCL) U2.4(SCL) U3.4(SCL) U4.2(A0) U4.4(SCL) U5.4(SCL) U6.4(SCL) U7.3 U7.4
SDA: J7.6 J11.4 R8.1 U1.3(SDA) U2.3(SDA) U3.2(A0) U3.3(SDA) U4.3(SDA) U5.3(SDA) U6.3(SDA) U7.9 U7.10
$1N117: LED1.1(K) R7.1

Not connected (* = marked no-connect by the designer): J7 2 4 5 8 9 10 13 14 15 16; J9 2 3 4 5 6 7 8 9 10 11 12 13 15 19 20; U7 5 6 7 8 13 14 15 16 17 18 23 24 25 26 27 28 29 30 31 32; U8 3 4 5 6 7 8 9 10 11 12 13 14 15 16 17 18 19 20 21 22 23 24 25 26 29 30 37 38 39 40

## Notes on the sheets
sheet 1
- Pull-up resistors
- Measurement Channels

# Board PCB1
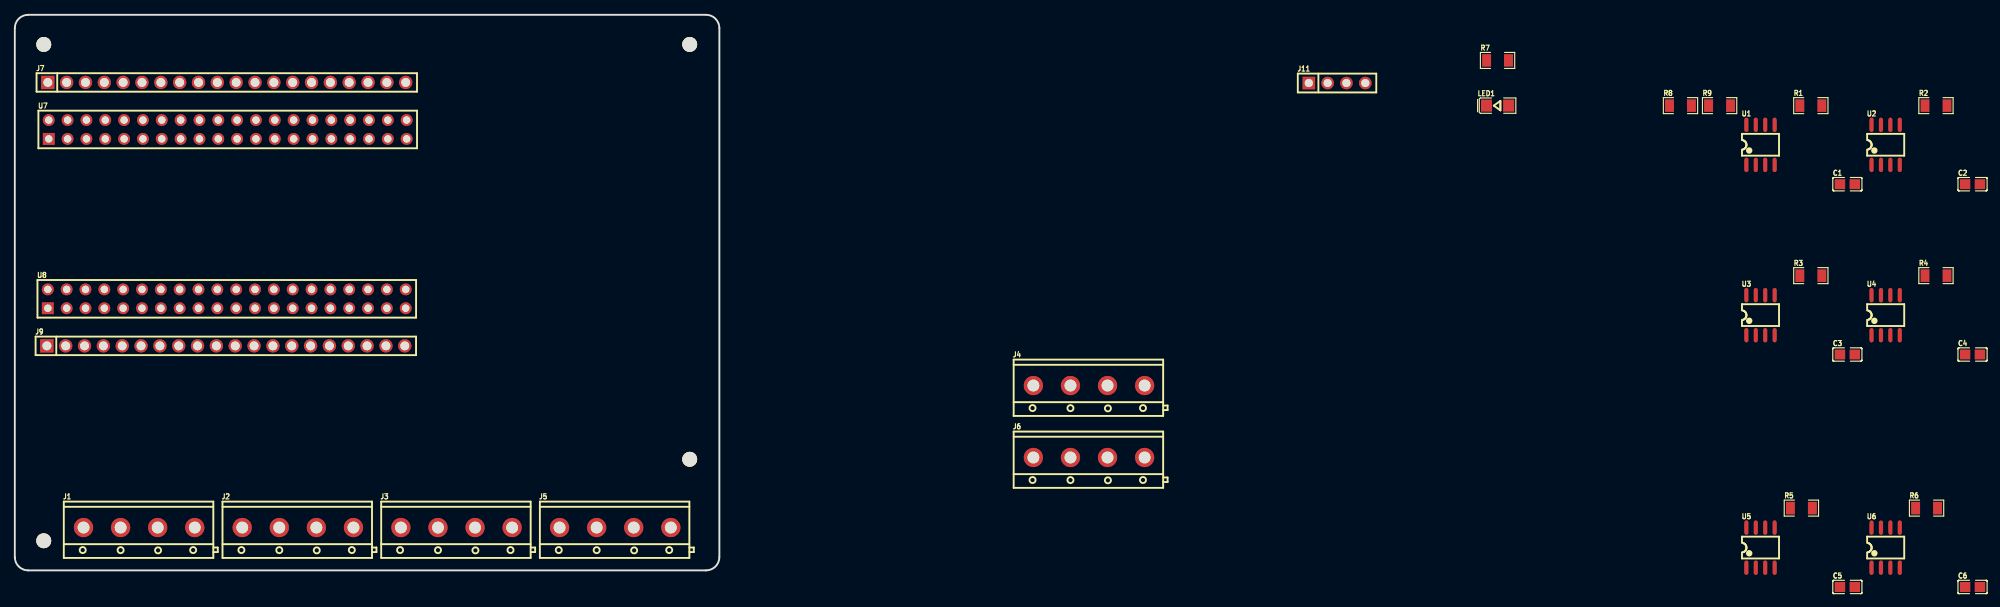
[diagram p4: board, top side]
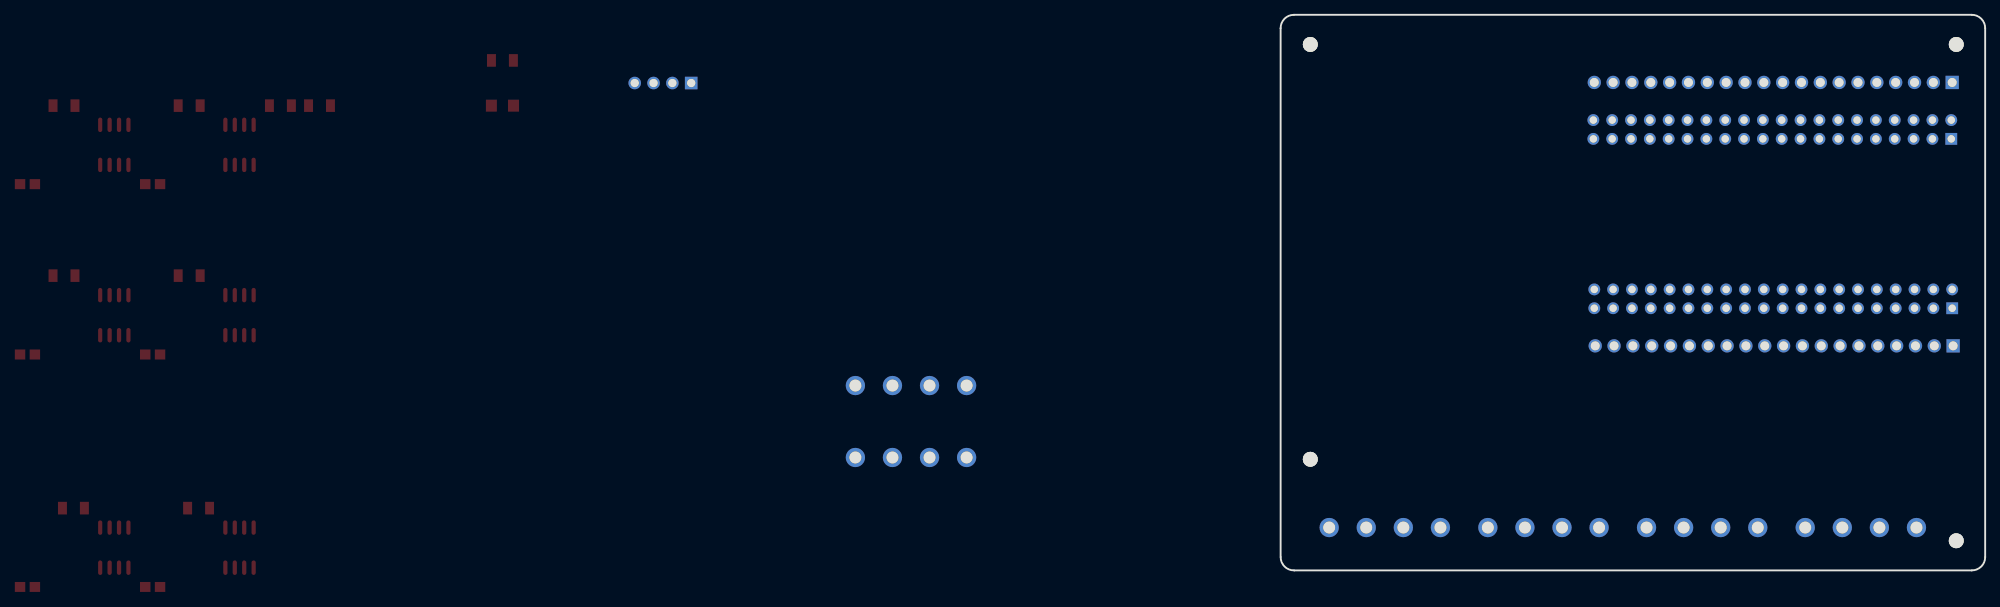
[diagram p5: board, bottom side, seen from below]

Outline 95 x 75 mm; copper layers: Top Layer, Bottom Layer. Coordinates in mm from the lower left corner of the outline.
Outline path: 0,73.2 0,1.8 arc(0.53,0.53) 1.8,0 93.2,0 arc(94.47,0.53) 95,1.8 95,73.2 arc(94.47,74.47) 93.2,75 1.8,75 arc(0.53,74.47) 0,73.2
Stack: Top Layer 0.035mm / Dielectric1 1.51mm FR4 er 4.5 / Bottom Layer 0.035mm

## Design rules (mm)
spacing copperThickness1oz (default): track to track 0.102, other pairs 0.152 to 0.3
spacing copperThickness2oz: track to track 0.203, other pairs 0.152 to 0.3
track width copperThickness1oz (default): min 0.127, default 0.254, max 2.54
track width copperThickness2oz: min 0.203, default 0.254, max 2.54
differential pair differentialPair (default): width min 0.127, default 0.254, max 2.54; gap min 0.152, default 0.152

## Placement (name value [footprint] x y rotation side)
C1  100nF  [C0805]  247.1 52.14 0 top
C2  100nF  [C0805]  263.98 52.14 0 top
C3  100nF  [C0805]  247.1 29.14 0 top
C4  100nF  [C0805]  263.98 29.14 0 top
C5  100nF  [C0805]  247.1 -2.24 0 top
C6  100nF  [C0805]  263.98 -2.24 0 top
J1  JL301-50004U02  [CONN-TH_4P-P5.00_JL301-50004U02]  16.76 5.78 0 top
J2  JL301-50004U02  [CONN-TH_4P-P5.00_JL301-50004U02]  38.16 5.78 0 top
J3  JL301-50004U02  [CONN-TH_4P-P5.00_JL301-50004U02]  59.56 5.78 0 top
J4  JL301-50004U02  [CONN-TH_4P-P5.00_JL301-50004U02]  144.84 24.95 0 top
J5  JL301-50004U02  [CONN-TH_4P-P5.00_JL301-50004U02]  80.95 5.78 0 top
J6  JL301-50004U02  [CONN-TH_4P-P5.00_JL301-50004U02]  144.84 15.24 0 top
J7  ZX-PM2.54-1-20PY  [HDR-TH_20P-P2.54-V-F]  28.58 65.87 0 top
J9  ZX-PM2.54-1-20PY  [HDR-TH_20P-P2.54-V-F]  28.45 30.31 0 top
J11  PM2.54-1*4  [HDR-TH_4P-P2.54-V-F]  178.29 65.79 0 top
LED1  XL-3216SURC  [LED1206-R-RD_RED]  199.93 62.74 0 top
R1  10mΩ  [R1206]  242.17 62.74 0 top
R2  10mΩ  [R1206]  259.05 62.74 0 top
R3  10mΩ  [R1206]  242.17 39.79 0 top
R4  100mΩ  [R1206]  259.05 39.79 0 top
R5  100mΩ  [R1206]  240.9 8.41 0 top
R6  100mΩ  [R1206]  257.78 8.41 0 top
R7  100Ω  [R1206]  199.93 68.84 0 top
R8  1kΩ  [R1206]  224.6 62.74 0 top
R9  1kΩ  [R1206]  229.87 62.74 0 top
SCREW1  -  [Screw-Hole-M2]  3.9 71 0 top
SCREW2  -  [Screw-Hole-M2]  91 71 0 top
SCREW3  -  [Screw-Hole-M2]  3.9 4 0 top
SCREW4  -  [Screw-Hole-M2]  91 15 0 top
U1  INA219BIDR  [SOIC-8_L5.0-W4.0-P1.27-LS6.1-BL]  235.39 57.44 0 top
U2  INA219BIDR  [SOIC-8_L5.0-W4.0-P1.27-LS6.1-BL]  252.26 57.44 0 top
U3  INA219BIDR  [SOIC-8_L5.0-W4.0-P1.27-LS6.1-BL]  235.39 34.45 0 top
U4  INA219BIDR  [SOIC-8_L5.0-W4.0-P1.27-LS6.1-BL]  252.26 34.45 0 top
U5  INA219BIDR  [SOIC-8_L5.0-W4.0-P1.27-LS6.1-BL]  235.39 3.07 0 top
U6  INA219BIDR  [SOIC-8_L5.0-W4.0-P1.27-LS6.1-BL]  252.26 3.07 0 top
U7  2.54-2*20  [HDR-TH_40P-P2.54-V-F-R2-C20-S2.54]  28.7 59.52 0 top
U8  2.54-2*20  [HDR-TH_40P-P2.54-V-F-R2-C20-S2.54]  28.58 36.66 0 top

## Footprints (pads in the part's own frame, mm; a bottom-side part is the same pattern mirrored in y, then rotated)
C0805
  rect 1.41x1.35 smd: 1(-1,0) 2(1,0)
CONN-TH_4P-P5.00_JL301-50004U02
  round 2.6 hole 1.6: 1(-7.5,0) 2(-2.5,0) 3(2.5,0) 4(7.5,0)
HDR-TH_4P-P2.54-V-F
  rect 1.7x1.7 hole 1.1: 1(-3.81,0)
  round 1.7 hole 1.1: 2(-1.27,0) 3(1.27,0) 4(3.81,0)
HDR-TH_20P-P2.54-V-F
  rect 1.8x1.8 hole 1.2: 1(-24.13,0)
  round 1.8 hole 1.2: 2(-21.59,0) 3(-19.05,0) 4(-16.51,0) 5(-13.97,0) 6(-11.43,0) 7(-8.89,0) 8(-6.35,0) 9(-3.81,0) 10(-1.27,0) 11(1.27,0) 12(3.81,0) 13(6.35,0) 14(8.89,0) 15(11.43,0) 16(13.97,0) 17(16.51,0) 18(19.05,0) 19(21.59,0) 20(24.13,0)
HDR-TH_40P-P2.54-V-F-R2-C20-S2.54
  rect 1.6x1.6 hole 1: 1(-24.13,-1.27)
  round 1.6 hole 1: 2(-24.13,1.27) 3(-21.59,-1.27) 4(-21.59,1.27) 5(-19.05,-1.27) 6(-19.05,1.27) 7(-16.51,-1.27) 8(-16.51,1.27) 9(-13.97,-1.27) 10(-13.97,1.27) 11(-11.43,-1.27) 12(-11.43,1.27) 13(-8.89,-1.27) 14(-8.89,1.27) 15(-6.35,-1.27) 16(-6.35,1.27) 17(-3.81,-1.27) 18(-3.81,1.27) 19(-1.27,-1.27) 20(-1.27,1.27) 21(1.27,-1.27) 22(1.27,1.27) 23(3.81,-1.27) 24(3.81,1.27) 25(6.35,-1.27) 26(6.35,1.27) 27(8.89,-1.27) 28(8.89,1.27) 29(11.43,-1.27) 30(11.43,1.27) 31(13.97,-1.27) 32(13.97,1.27) 33(16.51,-1.27) 34(16.51,1.27) 35(19.05,-1.27) 36(19.05,1.27) 37(21.59,-1.27) 38(21.59,1.27) 39(24.13,-1.27) 40(24.13,1.27)
LED1206-R-RD_RED
  rect 1.485x1.62 smd: 1(1.492,0) 2(-1.492,0)
R1206
  rect 1.208x1.701 smd: 1(-1.479,0) 2(1.479,0)
Screw-Hole-M2
  round 2 hole 2: 1(0,0)
SOIC-8_L5.0-W4.0-P1.27-LS6.1-BL
  oval 0.569x1.95 smd: 1(-1.905,-2.705) 2(-0.635,-2.705) 3(0.635,-2.705) 4(1.905,-2.705) 5(1.905,2.705) 6(0.635,2.705) 7(-0.635,2.705) 8(-1.905,2.705)

## Nets
As in the schematic.

Pads without a net: J7 2 4 5 8 9 10 13 14 15 16; J9 2 3 4 5 6 7 8 9 10 11 12 13 15 19 20; U7 5 6 7 8 13 14 15 16 17 18 23 24 25 26 27 28 29 30 31 32; U8 3 4 5 6 7 8 9 10 11 12 13 14 15 16 17 18 19 20 21 22 23 24 25 26 29 30 37 38 39 40

# Board PCB1_V2
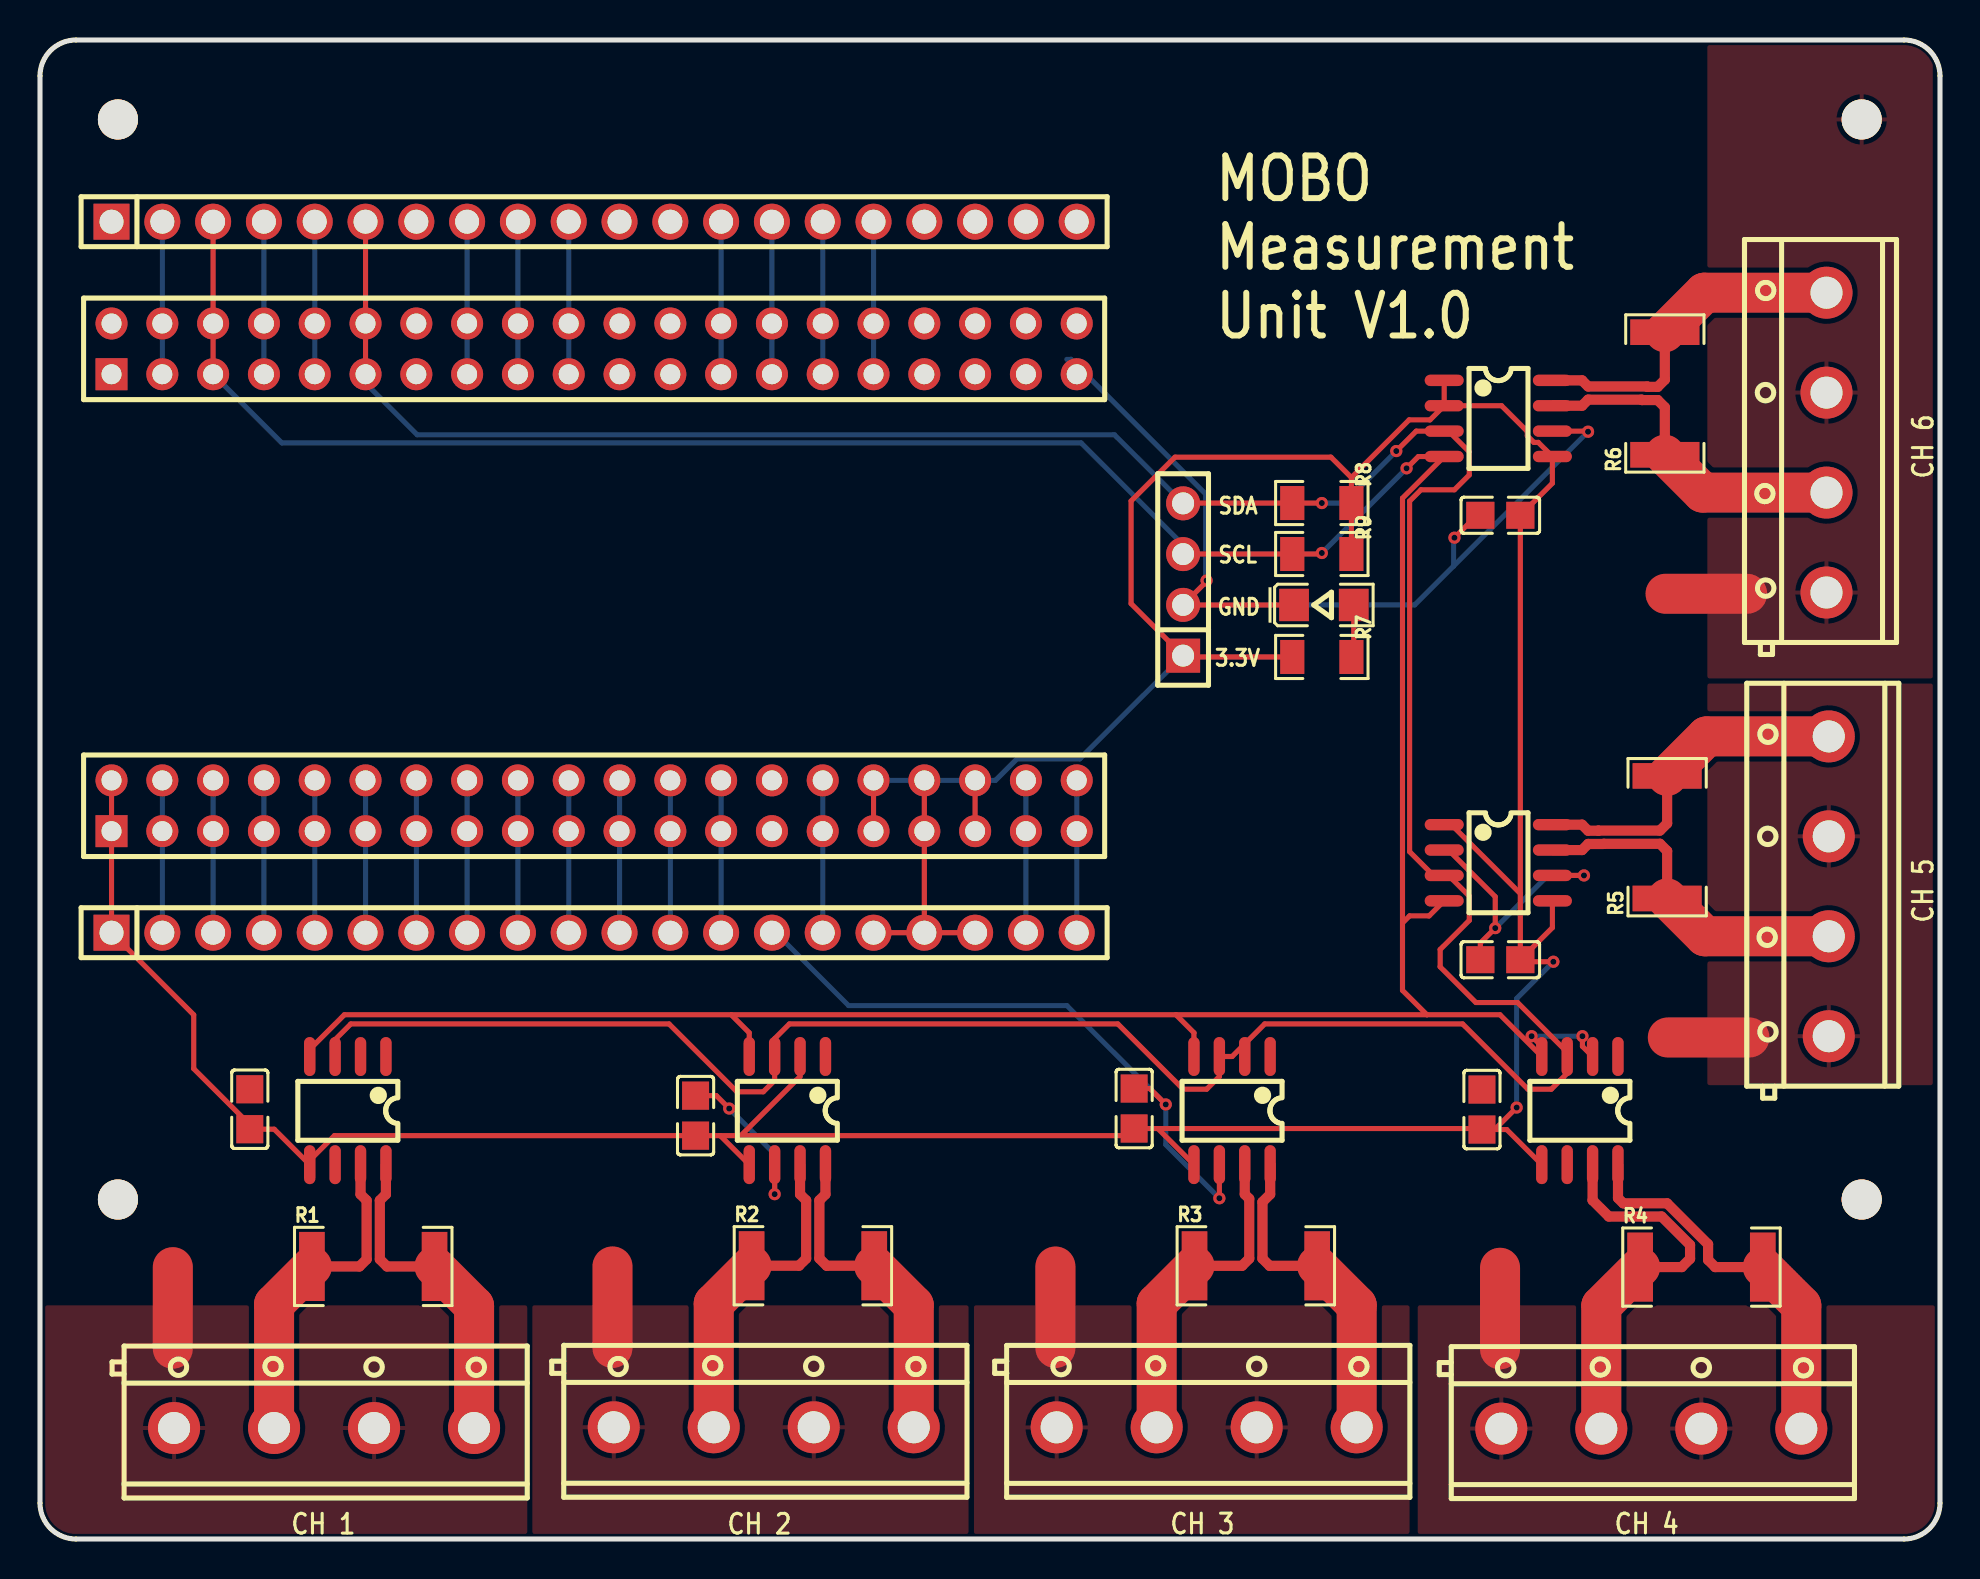
[diagram p6: board, top side]
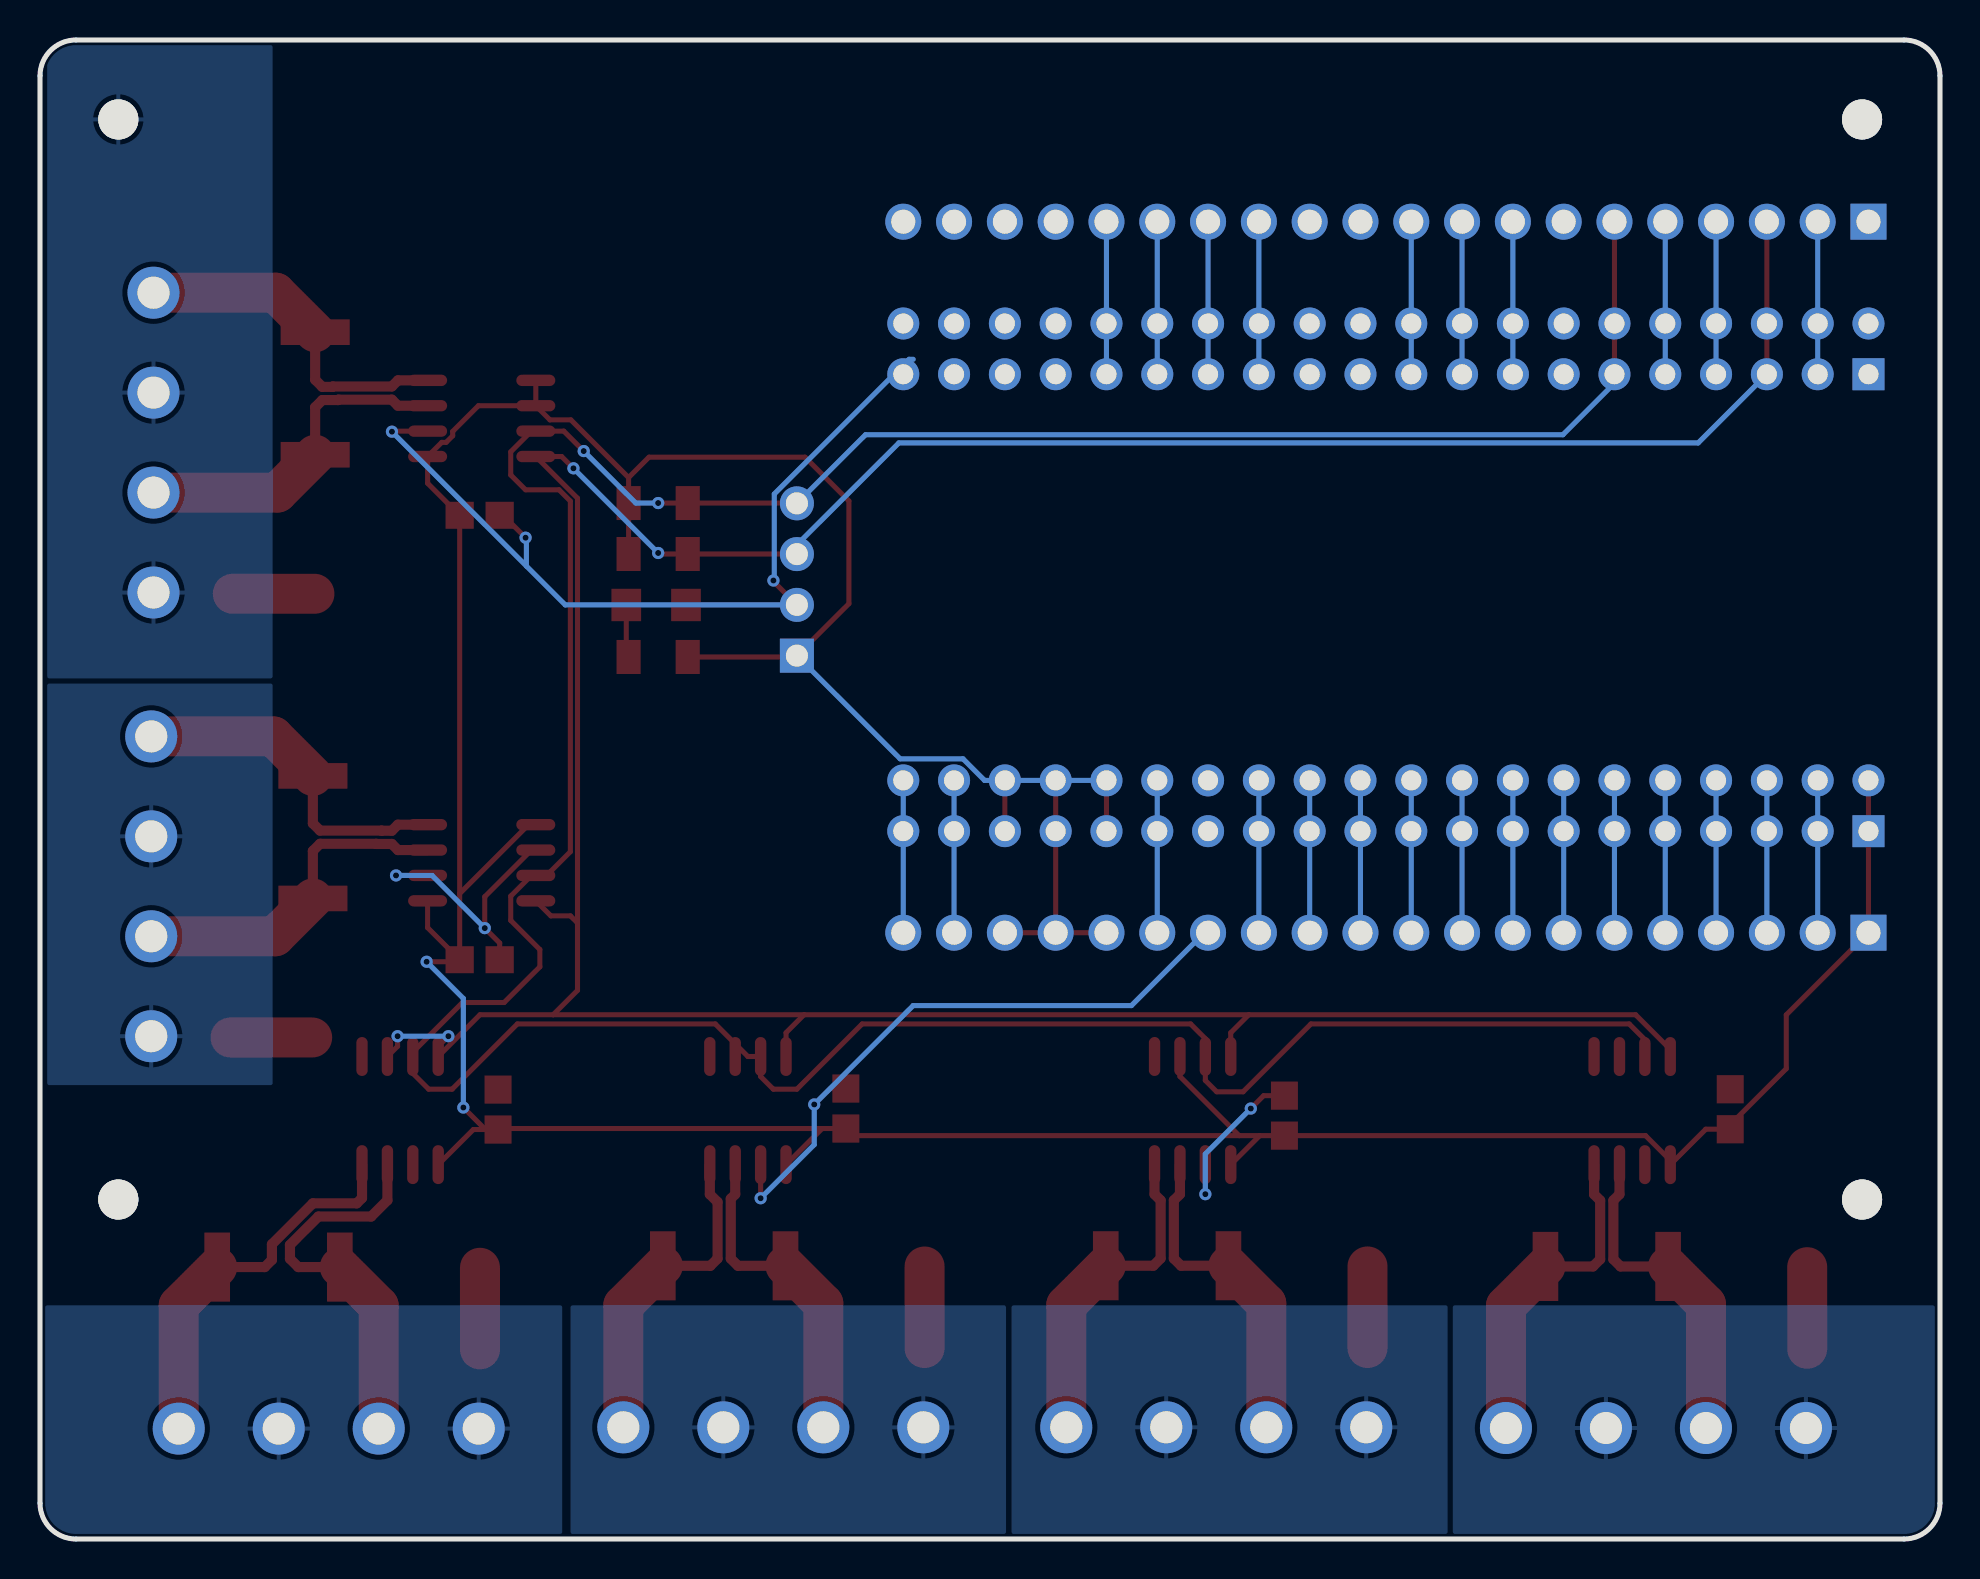
[diagram p7: board, bottom side, seen from below]

Outline 95 x 75 mm; copper layers: Top Layer, Bottom Layer. Coordinates in mm from the lower left corner of the outline.
Outline path: 0,73.2 0,1.8 arc(0.53,0.53) 1.8,0 93.2,0 arc(94.47,0.53) 95,1.8 95,73.2 arc(94.47,74.47) 93.2,75 1.8,75 arc(0.53,74.47) 0,73.2
Stack: Top Layer 0.035mm / Dielectric1 1.51mm FR4 er 4.5 / Bottom Layer 0.035mm

## Design rules (mm)
net CH3-: DP3
net CH3+: DP3
net CH1-: DP1
net CH1+: DP1
net CH5-: DP5
net CH5+: DP5
net CH6-: DP6
net CH6+: DP6
net CH2-: DP2
net CH2+: DP2
net CH4-: DP4
net CH4+: DP4
spacing copperThickness1oz (default): track to track 0.102, other pairs 0.152 to 0.3
spacing copperThickness2oz: track to track 0.203, other pairs 0.152 to 0.3
track width copperThickness1oz (default): min 0.127, default 0.254, max 2.54
track width copperThickness2oz: min 0.203, default 0.254, max 2.54
differential pair differentialPair (default): width min 0.127, default 0.254, max 2.54; gap min 0.152, default 0.152
net GND uses copperRegion

## Placement (name value [footprint] x y rotation side)
C1  100nF  [C0805]  10.49 21.5 270 top
C2  100nF  [C0805]  32.78 21.18 270 top
C3  100nF  [C0805]  54.71 21.54 270 top
C4  100nF  [C0805]  72.1 21.49 270 top
C5  100nF  [C0805]  73.02 28.98 0 top
C6  100nF  [C0805]  73.02 51.22 0 top
J1  JL301-50004U02  [CONN-TH_4P-P5.00_JL301-50004U02]  14.2 5.55 180 top
J2  JL301-50004U02  [CONN-TH_4P-P5.00_JL301-50004U02]  36.19 5.59 180 top
J3  JL301-50004U02  [CONN-TH_4P-P5.00_JL301-50004U02]  58.33 5.59 180 top
J4  JL301-50004U02  [CONN-TH_4P-P5.00_JL301-50004U02]  80.56 5.52 180 top
J5  JL301-50004U02  [CONN-TH_4P-P5.00_JL301-50004U02]  89.44 32.66 270 top
J6  JL301-50004U02  [CONN-TH_4P-P5.00_JL301-50004U02]  89.32 54.86 270 top
J7  ZX-PM2.54-1-20PY  [HDR-TH_20P-P2.54-V-F]  27.71 65.91 0 top
J9  ZX-PM2.54-1-20PY  [HDR-TH_20P-P2.54-V-F]  27.71 30.34 0 top
J11  PM2.54-1*4  [HDR-TH_4P-P2.54-V-F]  57.16 48.01 90 top
LED1  XL-3216SURC  [LED1206-R-RD_RED]  64.19 46.73 0 top
R1  10mΩ  [R2512]  16.66 13.64 0 top
R2  10mΩ  [R2512]  38.65 13.67 0 top
R3  10mΩ  [R2512]  60.79 13.67 0 top
R4  100mΩ  [R2512]  83.07 13.61 0 top
R5  100mΩ  [R2512]  81.36 35.11 90 top
R6  100mΩ  [R2512]  81.24 57.31 90 top
R7  100Ω  [R1206]  64.09 44.13 180 top
R8  1kΩ  [R1206]  64.09 51.83 0 top
R9  1kΩ  [R1206]  64.09 49.28 0 top
SCREW1  -  [Screw-Hole-M2]  3.9 71.02 0 top
SCREW2  -  [Screw-Hole-M2]  91.08 71.02 0 top
SCREW3  -  [Screw-Hole-M2]  3.9 16.99 0 top
SCREW4  -  [Screw-Hole-M2]  91.08 16.99 0 top
U1  INA219BIDR  [SOIC-8_L5.0-W4.0-P1.27-LS6.1-BL]  15.39 21.43 180 top
U2  INA219BIDR  [SOIC-8_L5.0-W4.0-P1.27-LS6.1-BL]  37.37 21.44 180 top
U3  INA219BIDR  [SOIC-8_L5.0-W4.0-P1.27-LS6.1-BL]  59.6 21.44 180 top
U4  INA219BIDR  [SOIC-8_L5.0-W4.0-P1.27-LS6.1-BL]  76.99 21.44 180 top
U5  INA219BIDR  [SOIC-8_L5.0-W4.0-P1.27-LS6.1-BL]  72.92 33.84 270 top
U6  INA219BIDR  [SOIC-8_L5.0-W4.0-P1.27-LS6.1-BL]  72.91 56.06 270 top
U7  2.54-2*20  [HDR-TH_40P-P2.54-V-F-R2-C20-S2.54]  27.71 59.55 0 top
U8  2.54-2*20  [HDR-TH_40P-P2.54-V-F-R2-C20-S2.54]  27.71 36.69 0 top

## Footprints (pads in the part's own frame, mm; a bottom-side part is the same pattern mirrored in y, then rotated)
C0805
  rect 1.41x1.35 smd: 1(-1,0) 2(1,0)
CONN-TH_4P-P5.00_JL301-50004U02
  round 2.6 hole 1.6: 1(-7.5,0) 2(-2.5,0) 3(2.5,0) 4(7.5,0)
HDR-TH_4P-P2.54-V-F
  rect 1.7x1.7 hole 1.1: 1(-3.81,0)
  round 1.7 hole 1.1: 2(-1.27,0) 3(1.27,0) 4(3.81,0)
HDR-TH_20P-P2.54-V-F
  rect 1.8x1.8 hole 1.2: 1(-24.13,0)
  round 1.8 hole 1.2: 2(-21.59,0) 3(-19.05,0) 4(-16.51,0) 5(-13.97,0) 6(-11.43,0) 7(-8.89,0) 8(-6.35,0) 9(-3.81,0) 10(-1.27,0) 11(1.27,0) 12(3.81,0) 13(6.35,0) 14(8.89,0) 15(11.43,0) 16(13.97,0) 17(16.51,0) 18(19.05,0) 19(21.59,0) 20(24.13,0)
HDR-TH_40P-P2.54-V-F-R2-C20-S2.54
  rect 1.6x1.6 hole 1: 1(-24.13,-1.27)
  round 1.6 hole 1: 2(-24.13,1.27) 3(-21.59,-1.27) 4(-21.59,1.27) 5(-19.05,-1.27) 6(-19.05,1.27) 7(-16.51,-1.27) 8(-16.51,1.27) 9(-13.97,-1.27) 10(-13.97,1.27) 11(-11.43,-1.27) 12(-11.43,1.27) 13(-8.89,-1.27) 14(-8.89,1.27) 15(-6.35,-1.27) 16(-6.35,1.27) 17(-3.81,-1.27) 18(-3.81,1.27) 19(-1.27,-1.27) 20(-1.27,1.27) 21(1.27,-1.27) 22(1.27,1.27) 23(3.81,-1.27) 24(3.81,1.27) 25(6.35,-1.27) 26(6.35,1.27) 27(8.89,-1.27) 28(8.89,1.27) 29(11.43,-1.27) 30(11.43,1.27) 31(13.97,-1.27) 32(13.97,1.27) 33(16.51,-1.27) 34(16.51,1.27) 35(19.05,-1.27) 36(19.05,1.27) 37(21.59,-1.27) 38(21.59,1.27) 39(24.13,-1.27) 40(24.13,1.27)
LED1206-R-RD_RED
  rect 1.485x1.62 smd: 1(1.492,0) 2(-1.492,0)
R1206
  rect 1.208x1.701 smd: 1(-1.479,0) 2(1.479,0)
R2512
  rect 1.282x3.456 smd: 1(-3.067,0) 2(3.067,0)
Screw-Hole-M2
  round 2 hole 2: 1(0,0)
SOIC-8_L5.0-W4.0-P1.27-LS6.1-BL
  oval 0.569x1.95 smd: 1(-1.905,-2.705) 2(-0.635,-2.705) 3(0.635,-2.705) 4(1.905,-2.705) 5(1.905,2.705) 6(0.635,2.705) 7(-0.635,2.705) 8(-1.905,2.705)

## Nets
As in the schematic.

## Via types
v1: diameter 0.61, hole 0.305, Top Layer to Bottom Layer, 17 vias

## Routing (per net, layer and track width the routed paths; a pad name or vN(x,y) marks a point on that pad's centre or on a via; arc(x,y) is an arc through that point)
+3.3V: length 223.4
  Top Layer w0.254: C5.2 75.62,30.59 U5.5 ; C5.2 74.02,32.29 ; C5.2 74.12,28.88 v1(75.67,28.88) ; 72.73,20.49 v1(73.83,21.59) ; 72.73,20.49 C4.2 72.05,20.54 55.89,20.54 ; 72.73,20.49 73.33,20.49 U4.5 ; U2.2 38,23.14 35.04,20.18 ; U6.2 73.08,56.7 74.37,55.41 74.37,55.2 74.7,54.87 74.91,54.87 U6.5 75.62,52.82 C6.2 74.02,32.29 ; U6.2 69.5,55.99 68.46,55.99 65.57,53.11 ; U6.2 U6.1 ; U5.1 70.57,35.74 74.02,32.29 ; 35.04,20.18 54.35,20.18 C3.2 55.89,20.54 ; 35.04,20.18 34.01,20.18 ; 65.57,53.11 64.55,54.13 56.75,54.13 54.55,51.93 54.55,46.8 J11.1 57.22,44.13 R7.2 ; 65.57,53.11 R8.2 R9.2 ; 55.89,20.54 U3.5 ; U8.2 U8.1 J9.1 7.69,26.23 7.69,23.53 10.49,20.73 C1.2 11.71,20.5 U1.5 13.49,18.95 14.72,20.18 C2.2 34.01,20.18 ; 34.01,20.18 U2.5 ; J9.17 J9.16 ; J9.17 U8.33 U8.34 ; J9.17 J9.18 ; U8.32 U8.31 ; U8.36 U8.35
  Bottom Layer w0.254: J11.1 51.99,39.03 48.85,39.03 47.77,37.96 U8.36 U8.34 U8.32 ; v1(75.67,28.88) 73.83,27.05 v1(73.83,21.59)
GND: length 130
  Top Layer w0.254: C6.1 71.84,51.22 v1(70.72,50.1) ; U3.6 v1(58.97,17.05) ; LED1.2 57.16,46.73 J11.2 58.33,47.91 v1(58.33,47.96) ; C2.1 33.82,22.18 v1(34.46,21.54) ; U2.6 v1(36.73,17.25) ; v1(77.4,55.4) 77.37,55.43 U6.6 ; C5.1 72.02,29.82 v1(72.76,30.56) 72.76,32.14 70.43,34.47 U5.2 ; v1(56.29,21.74) 55.49,22.54 C3.1 ; U5.6 v1(77.2,33.2)
  Top Layer w2: 6.64,9.52 6.64,13.6 ; 28.62,9.56 28.62,13.64 ; 50.77,9.55 50.77,13.63 ; 73,9.49 73,13.57 ; 85.36,47.29 81.28,47.29 ; 85.47,25.09 81.39,25.09
  Bottom Layer w0.254: v1(72.76,30.56) 75.4,33.2 v1(77.2,33.2) ; v1(34.46,21.54) 36.73,19.27 v1(36.73,17.25) ; 70.68,48.68 68.74,46.74 J11.2 ; 70.68,48.68 70.68,50.06 v1(70.72,50.1) ; 70.68,48.68 v1(77.4,55.4) ; v1(58.33,47.96) 58.28,48 58.28,52.28 51.55,59.02 51.34,59.02 ; J9.14 36.78,30.34 40.43,26.69 51.34,26.69 v1(56.29,21.74) 56.29,19.73 v1(58.97,17.05)
CH1+: length 16.6
  Top Layer w0.508: R1.2 17.35,13.64 16.99,14 16.99,16.94 17.3,17.25 U1.8
  Top Layer w2: R1.2 21.7,11.66 J1.1
CH1-: length 16.6
  Top Layer w0.508: R1.1 15.97,13.64 16.33,14 16.33,16.94 16.03,17.25 U1.7
  Top Layer w2: J1.3 11.7,11.74 R1.1
CH2+: length 16.6
  Top Layer w0.508: U2.8 39.27,17.25 38.97,16.94 38.97,14.04 39.33,13.67 R2.2
  Top Layer w2: 43.69,5.59 43.69,11.7 R2.2
CH2-: length 16.6
  Top Layer w0.508: U2.7 38,17.25 38.31,16.94 38.31,14.03 37.95,13.67 R2.1
  Top Layer w2: R2.1 33.69,11.78 J2.3
CH3+: length 16.6
  Top Layer w0.508: R3.2 61.48,13.67 61.12,14.03 61.12,16.86 61.51,17.25 U3.8
  Top Layer w2: R3.2 65.83,11.69 J3.1
CH3-: length 16.5
  Top Layer w0.508: U3.7 60.24,17.25 60.46,17.02 60.46,14.03 60.1,13.67 57.73,13.67
  Top Layer w2: 57.73,13.67 55.83,11.78 J3.3
CH4+: length 19.7
  Top Layer w0.508: U4.8 78.9,17.06 79.16,16.79 81.36,16.79 83.4,14.75 83.4,13.97 83.76,13.61 R4.2
  Top Layer w2: J4.1 88.06,11.68 R4.2
CH4-: length 19.8
  Top Layer w0.508: U4.7 77.63,16.95 78.44,16.13 81.08,16.13 82.5,14.71 82.5,14.02 82.09,13.61 80.01,13.61
  Top Layer w2: 80.01,13.61 78.06,11.66 J4.3
CH5+: length 17.3
  Top Layer w0.508: R5.2 81.36,35.8 81,35.44 77.92,35.44 77.92,35.44 77.41,35.44 77.1,35.74 U5.8
  Top Layer w2: R5.2 83.33,40.16 J5.1
CH5-: length 17.3
  Top Layer w0.508: R5.1 81.36,34.42 81,34.78 78.2,34.78 78.19,34.78 77.41,34.78 77.1,34.47 U5.7
  Top Layer w2: R5.1 83.25,30.16 J5.3
CH6+: length 17.2
  Top Layer w0.508: U6.8 77.1,57.97 77.41,57.66 80.35,57.66 80.38,57.64 80.88,57.64 81.24,58 R6.2
  Top Layer w2: J6.1 83.22,62.36 R6.2
CH6-: length 17.1
  Top Layer w0.508: U6.7 77.1,56.7 77.41,57 80.08,57 80.1,56.98 80.88,56.98 81.24,56.62 R6.1
  Top Layer w2: R6.1 83.13,52.36 J6.3
ESP_1: length 7.6
  Bottom Layer w0.254: U8.4 U8.3 J9.2
ESP_2: length 7.6
  Bottom Layer w0.254: J9.3 U8.5 U8.6
ESP_3: length 7.6
  Bottom Layer w0.254: J9.4 U8.7 U8.8
ESP_4: length 7.6
  Bottom Layer w0.254: U8.10 U8.9 J9.5
ESP_5: length 7.6
  Bottom Layer w0.254: J9.6 U8.11 U8.12
ESP_6: length 7.6
  Bottom Layer w0.254: J9.7 U8.13 U8.14
ESP_7: length 7.6
  Bottom Layer w0.254: J9.8 U8.15 U8.16
ESP_8: length 7.6
  Bottom Layer w0.254: U8.18 U8.17 J9.9
ESP_9: length 7.6
  Bottom Layer w0.254: U8.20 U8.19 J9.10
ESP_10: length 7.6
  Bottom Layer w0.254: U8.22 U8.21 J9.11
ESP_11: length 7.6
  Bottom Layer w0.254: U8.24 U8.23 J9.12
ESP_12: length 7.6
  Bottom Layer w0.254: J9.13 U8.25 U8.26
ESP_13: length 7.6
  Bottom Layer w0.254: J9.15 U8.29 U8.30
ESP_14: length 7.6
  Bottom Layer w0.254: J9.19 U8.37 U8.38
ESP_15: length 7.6
  Bottom Layer w0.254: J9.20 U8.39 U8.40
ESP_16: length 7.6
  Bottom Layer w0.254: U7.3 U7.4 J7.2
ESP_17: length 7.6
  Bottom Layer w0.254: U7.7 U7.8 J7.4
ESP_18: length 7.6
  Bottom Layer w0.254: J7.5 U7.10 U7.9
ESP_19: length 7.6
  Bottom Layer w0.254: U7.15 U7.16 J7.8
ESP_20: length 7.6
  Bottom Layer w0.254: U7.17 U7.18 J7.9
ESP_21: length 7.6
  Bottom Layer w0.254: U7.19 U7.20 J7.10
ESP_22: length 7.6
  Bottom Layer w0.254: J7.13 U7.26 U7.25
ESP_23: length 7.6
  Bottom Layer w0.254: J7.14 U7.28 U7.27
ESP_24: length 7.6
  Bottom Layer w0.254: J7.15 U7.30 U7.29
ESP_25: length 7.6
  Bottom Layer w0.254: J7.16 U7.32 U7.31
SCL: length 180.5
  Top Layer w0.254: v1(74.58,25.16) 75.09,24.65 U4.4 73,26.23 69.34,26.23 ; U5.4 69.46,31.18 68.48,31.18 68.12,30.82 ; v1(64.09,49.33) 64.04,49.28 R9.1 57.16,49.28 J11.3 ; 69.34,26.23 68.12,27.45 68.12,30.82 ; 69.34,26.23 56.8,26.23 ; 56.8,26.23 34.56,26.23 ; 56.8,26.23 57.7,25.33 U3.4 ; J7.3 U7.6 U7.5 ; U2.4 35.46,25.33 34.56,26.23 ; 68.12,30.82 68.12,52.08 U6.4 68.92,54.16 v1(68.33,53.57) ; U4.2 77.12,24.65 v1(77.12,25.16) ; U1.4 13.49,24.5 15.22,26.23 34.56,26.23
  Bottom Layer w0.254: U7.5 12.09,54.84 52.06,54.84 57.16,49.74 J11.3 ; v1(74.58,25.16) v1(77.12,25.16) ; v1(64.09,49.33) v1(68.33,53.57)
SDA: length 179
  Top Layer w0.254: v1(67.81,54.43) 68.81,55.43 U6.3 70.32,55.54 71.46,54.39 71.46,53.24 70.72,52.49 69.05,52.49 68.48,51.93 68.48,34.39 69.67,33.2 U5.3 70.43,33.2 71.46,32.16 71.46,30.95 70.01,29.49 70.01,28.63 71.79,26.84 73.88,26.84 76.36,24.36 U4.3 76.36,23.3 75.57,22.51 74.39,22.51 71.13,25.77 61.24,25.77 59.61,24.14 U3.3 58.97,23.14 58.33,22.51 57.16,22.51 53.89,25.77 37.47,25.77 36.73,25.03 U2.3 36.73,22.94 36.17,22.38 34.85,22.38 31.45,25.77 15.54,25.77 14.76,24.99 U1.3 ; U7.11 U7.12 J7.6 ; v1(64.09,51.83) R8.1 57.17,51.83 J11.4
  Bottom Layer w0.254: J11.4 53.72,55.25 18.85,55.25 16.28,57.83 U7.11 ; v1(67.81,54.43) 65.21,51.83 v1(64.09,51.83)
$1N117: length 2.6
  Top Layer w0.254: R7.1 65.69,44.25 LED1.1

## Copper pours and planes (outline as drawn; the poured copper is in the pictures)
GND on Top Layer: 83.37,75.24 94.64,75.24 94.64,43.06 83.37,43.06
GND on Top Layer: 0,11.69 24.36,11.69 24.36,0 0,0
GND on Top Layer: 24.62,11.69 46.43,11.69 46.43,0.01 24.62,0.01
GND on Top Layer: 68.89,11.69 95.08,11.69 95.08,0 68.89,0
GND on Top Layer: 46.7,11.69 68.48,11.69 68.48,0 46.7,0
GND on Top Layer: 83.37,42.8 94.64,42.8 94.64,22.71 83.37,22.71
GND on Bottom Layer: 0,11.69 24.36,11.69 24.36,0 0,0
GND on Bottom Layer: 46.7,11.69 68.48,11.69 68.48,0 46.7,0
GND on Bottom Layer: 24.62,11.69 46.43,11.69 46.43,0.01 24.62,0.01
GND on Bottom Layer: 83.37,42.8 94.64,42.8 94.64,22.71 83.37,22.71
GND on Bottom Layer: 83.37,75.24 94.64,75.24 94.64,43.06 83.37,43.06
GND on Bottom Layer: 68.89,11.69 95.08,11.69 95.08,0 68.89,0

## Text on the board
Top Silkscreen Layer: 3.3V | GND | SDA | SCL | CH 1 | CH 2 | CH 3 | CH 4 | CH 6 | CH 5 | MOBO / Measurement / Unit V1.0
